# Altium project 5-SignalLight.PrjPcb (part 1 of 2)
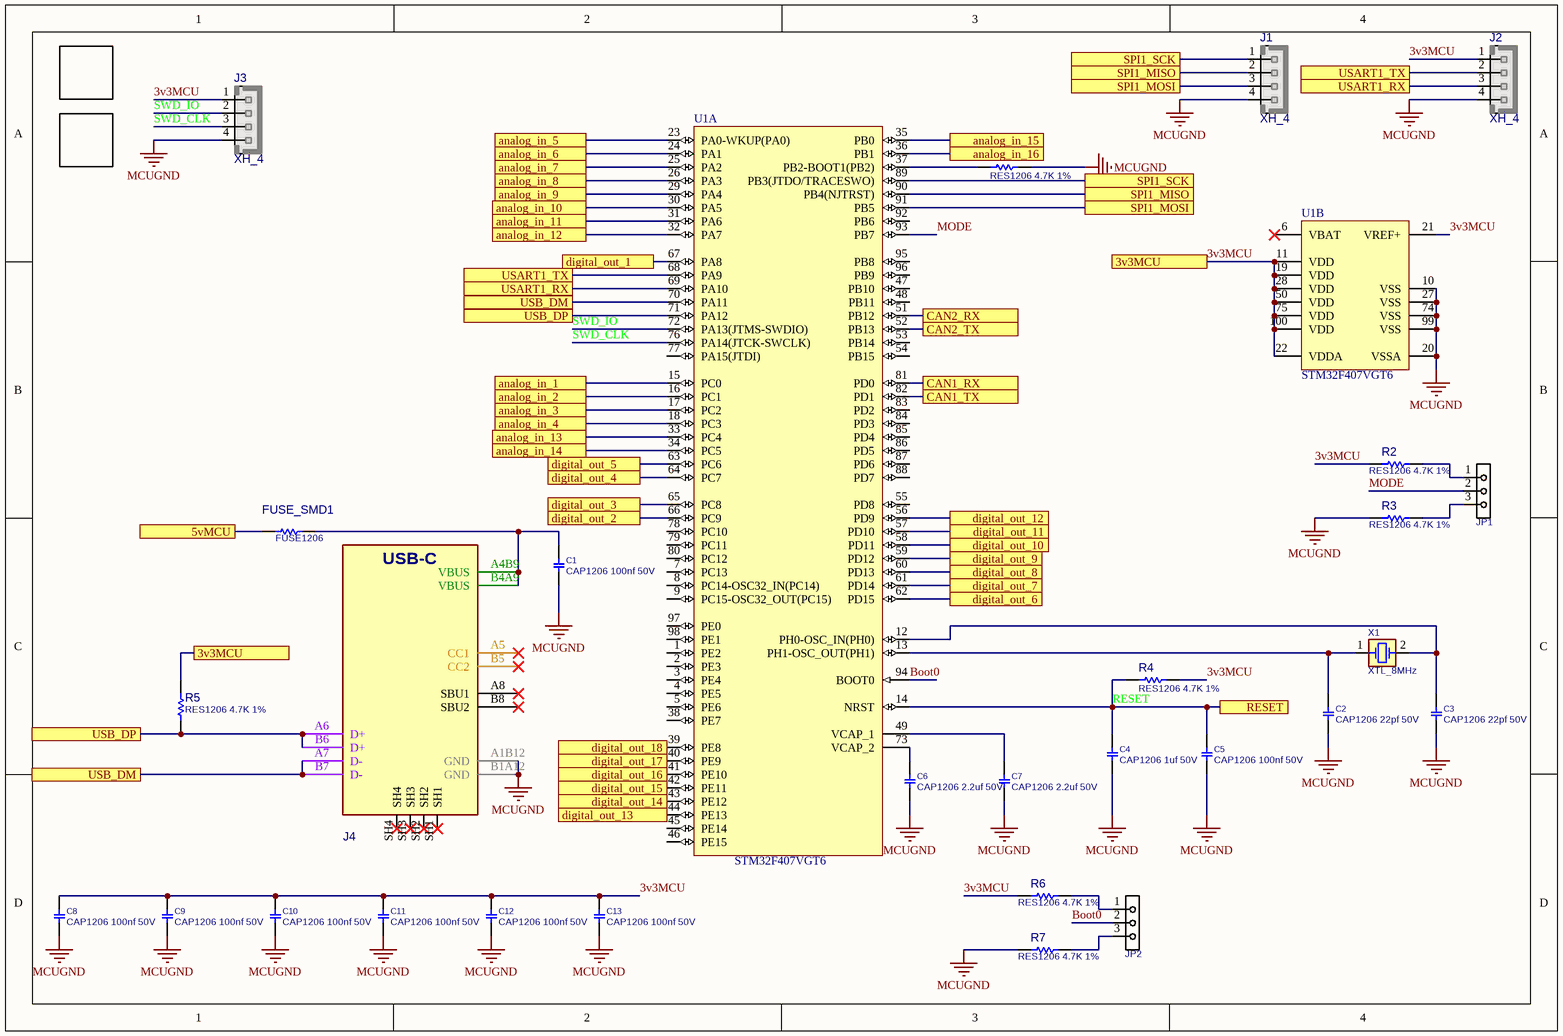
[diagram p0: MCU.SchDoc]
21 sheets, 460 parts. Net scope: flat (ports and power ports of the same name join across sheets).
Board file: SL-PCB1.PcbDoc
Sheets:
  MCU.SchDoc
  CAN.SchDoc
  power.SchDoc
  signal-light-1.SchDoc
  signal-light-2.SchDoc
  signal-light-3.SchDoc
  signal-light-4.SchDoc
  signal-light-5.SchDoc
  signal-light-6.SchDoc
  signal-light-7.SchDoc
  signal-light-8.SchDoc
  signal-light-9.SchDoc
  signal-light-10.SchDoc
  signal-light-11.SchDoc
  signal-light-12.SchDoc
  signal-light-13.SchDoc
  signal-light-14.SchDoc
  signal-light-15.SchDoc
  signal-light-16.SchDoc
  signal-light-17.SchDoc
  signal-light-18.SchDoc

## Sheet MCU.SchDoc
size A4; DocumentNumber: 1; SheetNumber: 1; SheetTotal: 21

### Parts
C1  CAP1206 100nf 50V  [C1206]
C2  CAP1206 22pf 50V  [C1206]
C3  CAP1206 22pf 50V  [C1206]
C4  CAP1206 1uf 50V  [C1206]
C5  CAP1206 100nf 50V  [C1206]
C6  CAP1206 2.2uf 50V  [C1206]
C7  CAP1206 2.2uf 50V  [C1206]
C8  CAP1206 100nf 50V  [C1206]
C9  CAP1206 100nf 50V  [C1206]
C10  CAP1206 100nf 50V  [C1206]
C11  CAP1206 100nf 50V  [C1206]
C12  CAP1206 100nf 50V  [C1206]
C13  CAP1206 100nf 50V  [C1206]
FUSE_SMD1  FUSE1206  [R1206]
J1  XH_4  [XH_4]
J2  XH_4  [XH_4]
J3  XH_4  [XH_4]
J4  DX07S016JA1  [USBC_SMD_16_DX07S016JA1]  (value not drawn)
JP1  JMPHDR3PIN  [JPH_3]  (value not drawn)
JP2  JMPHDR3PIN  [JPH_3]  (value not drawn)
R1  RES1206 4.7K 1%  [R1206]
R2  RES1206 4.7K 1%  [R1206]
R3  RES1206 4.7K 1%  [R1206]
R4  RES1206 4.7K 1%  [R1206]
R5  RES1206 4.7K 1%  [R1206]
R6  RES1206 4.7K 1%  [R1206]
R7  RES1206 4.7K 1%  [R1206]
RAMON1  WWW.RAMONIC.COM  [PCBComponent_1]  (value not drawn)
RAMON2  WWW.RAMONIC.COM  [PCBComponent_1]  (value not drawn)
U1  STM32F407VGT6  [STM-LQFP100_N]  (parts A,B of 2)
X1  XTL_8MHz  [XTL_2_11X5]

### Ports
3v3MCU, 5vMCU, analog_in_1, analog_in_2, analog_in_3, analog_in_4, analog_in_5, analog_in_6, analog_in_7, analog_in_8, analog_in_9, analog_in_10, analog_in_11, analog_in_12, analog_in_13, analog_in_14, analog_in_15, analog_in_16, CAN1_RX, CAN1_TX, CAN2_RX, CAN2_TX, digital_out_1, digital_out_2, digital_out_3, digital_out_4, digital_out_5, digital_out_6, digital_out_7, digital_out_8, digital_out_9, digital_out_10, digital_out_11, digital_out_12, digital_out_13, digital_out_14, digital_out_15, digital_out_16, digital_out_17, digital_out_18, RESET, SPI1_MISO, SPI1_MOSI, SPI1_SCK, USART1_RX, USART1_TX, USB_DM, USB_DP

### Nets
MCUGND: C1.1 C2.1 C3.1 C4.1 C5.1 C6.1 C7.1 C8.1 C9.1 C10.1 C11.1 C12.1 C13.1 J1.4 J2.4 J3.4 J4.A1B12(GND) J4.B1A12(GND) R1.2 R3.2 R7.2 U1.10(VSS) U1.20(VSSA) U1.27(VSS) U1.74(VSS) U1.99(VSS)
3v3MCU: C8.2 C9.2 C10.2 C11.2 C12.2 C13.2 J2.1 J3.1 R2.2 R4.2 R5.1 R6.2 U1.11(VDD) U1.19(VDD) U1.21(VREF+) U1.22(VDDA) U1.28(VDD) U1.50(VDD) U1.75(VDD) U1.100(VDD) ; port 3v3MCU
5vMCU: FUSE_SMD1.1 ; port 5vMCU
analog_in_1: U1.15(PC0) ; port analog_in_1
analog_in_2: U1.16(PC1) ; port analog_in_2
analog_in_3: U1.17(PC2) ; port analog_in_3
analog_in_4: U1.18(PC3) ; port analog_in_4
analog_in_5: U1.23(PA0-WKUP(PA0)) ; port analog_in_5
analog_in_6: U1.24(PA1) ; port analog_in_6
analog_in_7: U1.25(PA2) ; port analog_in_7
analog_in_8: U1.26(PA3) ; port analog_in_8
analog_in_9: U1.29(PA4) ; port analog_in_9
analog_in_10: U1.30(PA5) ; port analog_in_10
analog_in_11: U1.31(PA6) ; port analog_in_11
analog_in_12: U1.32(PA7) ; port analog_in_12
analog_in_13: U1.33(PC4) ; port analog_in_13
analog_in_14: U1.34(PC5) ; port analog_in_14
analog_in_15: U1.35(PB0) ; port analog_in_15
analog_in_16: U1.36(PB1) ; port analog_in_16
Boot0: JP2.2 U1.94(BOOT0)
MODE: JP1.2 U1.93(PB7)
RESET: C4.2 C5.2 R4.1 U1.14(NRST) ; port RESET
SWD_CLK: J3.3 U1.76(PA14(JTCK-SWCLK))
SWD_IO: J3.2 U1.72(PA13(JTMS-SWDIO))
NetB1_1: U1.81(PD0) ; port CAN1_RX
NetB1_4: U1.82(PD1) ; port CAN1_TX
NetB2_1: U1.51(PB12) ; port CAN2_RX
NetB2_4: U1.52(PB13) ; port CAN2_TX
NetC1_2: C1.2 FUSE_SMD1.2 J4.A4B9(VBUS) J4.B4A9(VBUS)
NetC2_2: C2.2 U1.13(PH1-OSC_OUT(PH1)) X1.1(OSC1)
NetC3_2: C3.2 U1.12(PH0-OSC_IN(PH0)) X1.2(OSC2)
NetC6_2: C6.2 U1.73(VCAP_2)
NetC7_2: C7.2 U1.49(VCAP_1)
NetJ1_1: J1.1 U1.89(PB3(JTDO/TRACESWO)) ; port SPI1_SCK
NetJ1_2: J1.2 U1.90(PB4(NJTRST)) ; port SPI1_MISO
NetJ1_3: J1.3 U1.91(PB5) ; port SPI1_MOSI
NetJ2_2: J2.2 U1.68(PA9) ; port USART1_TX
NetJ2_3: J2.3 U1.69(PA10) ; port USART1_RX
NetJ4_A6: J4.A6(D+) J4.B6(D+) R5.2 U1.71(PA12) ; port USB_DP
NetJ4_A7: J4.A7(D-) J4.B7(D-) U1.70(PA11) ; port USB_DM
NetJP1_1: JP1.1 R2.1
NetJP1_3: JP1.3 R3.1
NetJP2_1: JP2.1 R6.1
NetJP2_3: JP2.3 R7.1
NetR1_1: R1.1 U1.37(PB2-BOOT1(PB2))
NetR26_1: U1.67(PA8) ; port digital_out_1
NetR37_1: U1.66(PC9) ; port digital_out_2
NetR48_1: U1.65(PC8) ; port digital_out_3
NetR59_1: U1.64(PC7) ; port digital_out_4
NetR70_1: U1.63(PC6) ; port digital_out_5
NetR81_1: U1.62(PD15) ; port digital_out_6
NetR92_1: U1.61(PD14) ; port digital_out_7
NetR103_1: U1.60(PD13) ; port digital_out_8
NetR114_1: U1.59(PD12) ; port digital_out_9
NetR125_1: U1.58(PD11) ; port digital_out_10
NetR136_1: U1.57(PD10) ; port digital_out_11
NetR147_1: U1.56(PD9) ; port digital_out_12
NetR158_1: U1.44(PE13) ; port digital_out_13
NetR169_1: U1.43(PE12) ; port digital_out_14
NetR180_1: U1.42(PE11) ; port digital_out_15
NetR191_1: U1.41(PE10) ; port digital_out_16
NetR202_1: U1.40(PE9) ; port digital_out_17
NetR212_1: U1.39(PE8) ; port digital_out_18

Not connected (* = marked no-connect by the designer): J4 A5(CC1)* A8(SBU1)* B5(CC2)* B8(SBU2)* SH1* SH2* SH3* SH4*; U1 1(PE2) 2(PE3) 3(PE4) 4(PE5) 5(PE6) 6(VBAT)* 7(PC13) 8(PC14-OSC32_IN(PC14)) 9(PC15-OSC32_OUT(PC15)) 38(PE7) 45(PE14) 46(PE15) 47(PB10) 48(PB11) 53(PB14) 54(PB15) 55(PD8) 77(PA15(JTDI)) 78(PC10) 79(PC11) 80(PC12) 83(PD2) 84(PD3) 85(PD4) 86(PD5) 87(PD6) 88(PD7) 92(PB6) 95(PB8) 96(PB9) 97(PE0) 98(PE1)

### Notes on the sheet
- (in symbol CONN_USBC_SMD_16_DX07S016JA1) USB-C

### Library data of the parts
C1-C13 = CAP_SMD_MLCC_1206: CAP, MLCC; PARAM: -, -%; MANF_P#: MANF_PART#; PARAM2: -V; PRICE: 100= 1$; MANF: -; ASSEMBLY: ASSEMBLY
FUSE_SMD1 = RES_SMD_1206: resetable fuse; PARAM: 1%, 0.25W; DESC: DESCRIPTION; DIST#: MOUSER; MANF_P#: -; MANF: -; ASSEMBLY: ASSEMBLY; PRICE: -; PARAM2: -; VALUE: FUSE1206
J1-J3 = XH_4: PW10-x-M, JST-BxB-XH-A pitch: 2.5mm, 3A/250v; MANF: JST; MANF_P#: B4B-XH-A; PARAM2: 250v; PARAM: 3.0A; VALUE: XH_4
J4 = CONN_USBC_SMD_16_DX07S016JA1: CONN, USB, Type C, USB 2.0, Right-Angle, SMD; MANF: JAE; MANF_P#: DX07S016JA1R1500; PARAM: 5A; Price: 1.5$; Value: DX07S016JA1
JP1 JP2 = JUMPER_HDR_3P: JUMPER, HEADER 3PIN; MANF: MANF; MANF_P#: MANF_P#; VALUE: JMPHDR3PIN
R1-R7 = RES_SMD_1206: RESISTOR, SMD; PARAM: 1%, 0.25W; DESC: DESCRIPTION; DIST#: MOUSER; MANF_P#: -; MANF: -; ASSEMBLY: ASSEMBLY; PRICE: -; PARAM2: -
RAMON1 RAMON2 = RamonLogo
U1 = STM32F407VGT6: ARM Cortex-M4 32-bit MCU+FPU, 210 DMIPS, 1024 kB Flash, 192 kB Internal RAM, 82 I/Os, 100-pin LQFP, -40 to 85 degC, Tray; Manufacturer: STMicroelectronics; D/A Converter: 2x12-bit; FLASH Size (Prog) (kB): 1024; I/Os (High Current): 82; Internal RAM Size (kB): 192; Operating Frequency(F) (Processor speed) (MHz): 168; Supply Voltage(Vcc) max (V): 3.6; Supply Voltage(Vcc) min (V): 1.8; DatasheetVersion: Rev. 4; PackageVersion: Rev. 1, 06/2013; PackageReference: LQFP100; PackageDescription: 100-Pin Low Profile Quad Flat Package, 14 x 14 mm Body, 0.5 mm Pitch; Supplier 1: Digi-Key; Supplier Part Number 1: 497-11605-ND; Supplier 2: Farnell; Supplier Part Number 2: 2064368; Supplier 3: Newark; Supplier Part Number 3: 73T2333; Supplier 4: Mouser; Supplier Part Number 4: 511-STM32F407VGT6; Core: ARM Cortex-M4; Packing: Tray; Mounting Technology: Surface Mount; PartNumber: STM32F407VGT6; ComponentLink1Description: Manufacturer URL; ComponentLink1URL: http://www.st.com/web/en/home.html; ComponentLink2Description: Datasheet; ComponentLink2URL: http://www.st.com/st-web-ui/static/active/en/resource/technical/document/datasheet/DM00037051.pdf; ComponentLink3Description: Package Specification; ComponentLink3URL: http://www.st.com/st-web-ui/static/active/en/resource/technical/document/data_brief/DM00071938.pdf
X1 = XTL_2_HC49_8MHz_SMD: Crystal MOST POPULAR ABL HC49 PACKAGE; MANF: ABRACON; MANF_P#: ABLS-8.000MHZ-B4-T; PARAM: 8MHz, 18pF, 30PPM, -20~70oC; PRICE: 0.3$; VALUE: XTL_8MHz

## Sheet CAN.SchDoc
size A4; SheetNumber: 2; SheetTotal: 21
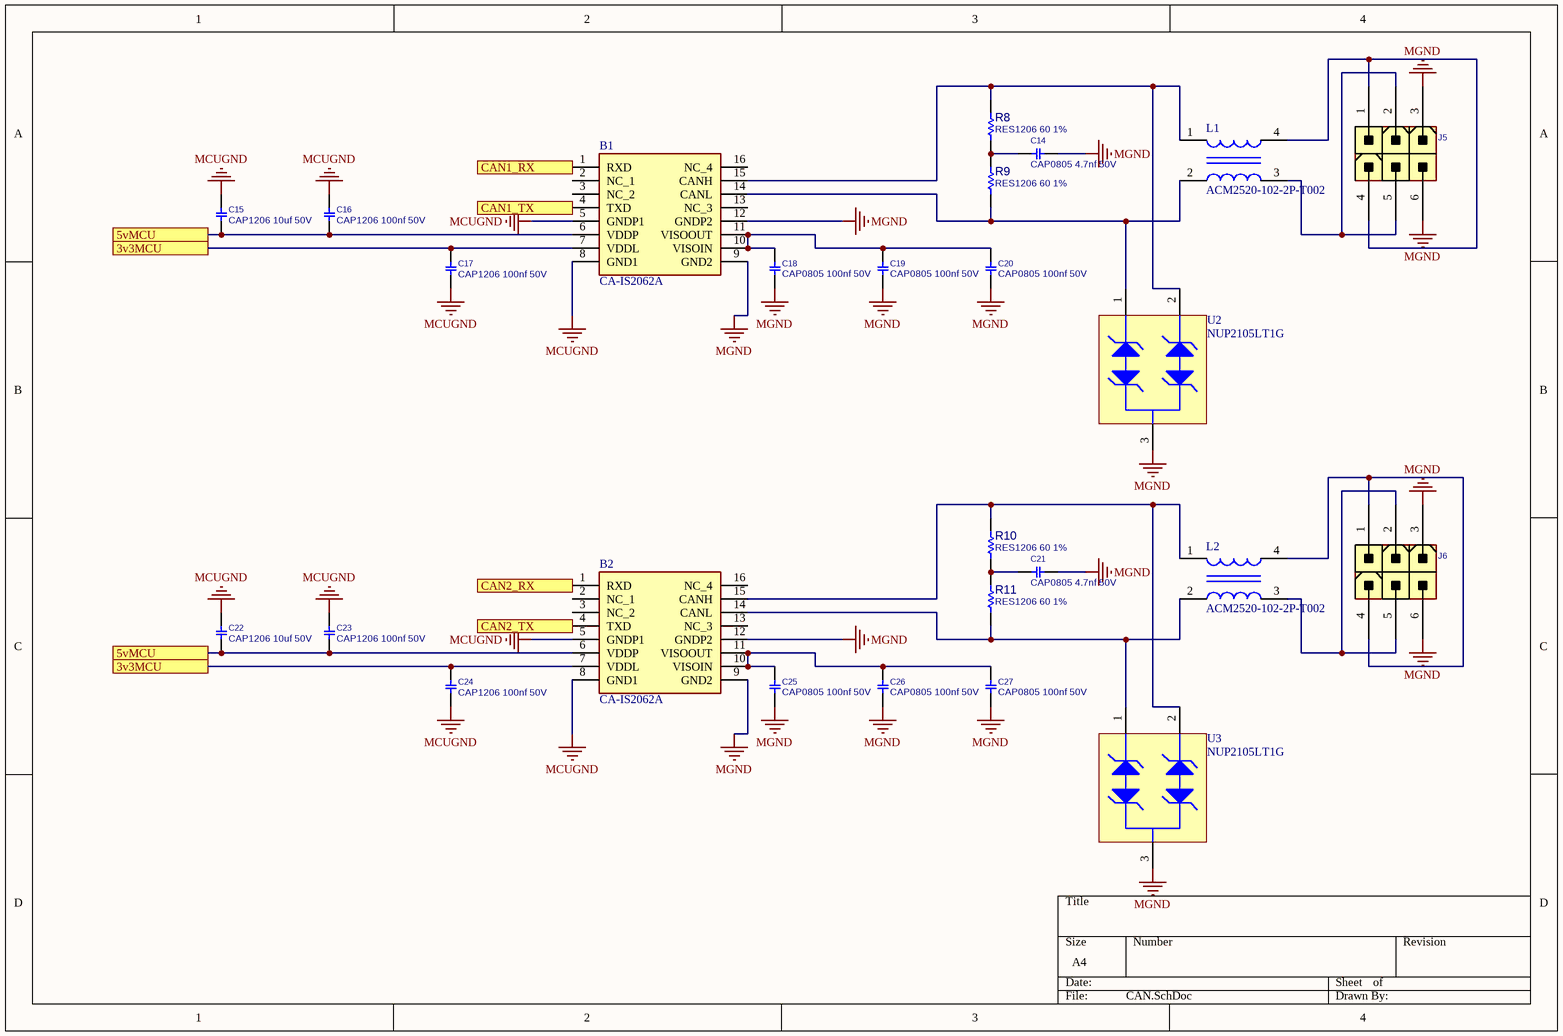
[diagram p1: CAN.SchDoc]

### Parts
B1  CA-IS2062A  [CAIS2062A]
B2  CA-IS2062A  [CAIS2062A]
C14  CAP0805 4.7nf 50V  [C0805]
C15  CAP1206 10uf 50V  [C1206]
C16  CAP1206 100nf 50V  [C1206]
C17  CAP1206 100nf 50V  [C1206]
C18  CAP0805 100nf 50V  [C0805]
C19  CAP0805 100nf 50V  [C0805]
C20  CAP0805 100nf 50V  [C0805]
C21  CAP0805 4.7nf 50V  [C0805]
C22  CAP1206 10uf 50V  [C1206]
C23  CAP1206 100nf 50V  [C1206]
C24  CAP1206 100nf 50V  [C1206]
C25  CAP0805 100nf 50V  [C0805]
C26  CAP0805 100nf 50V  [C0805]
C27  CAP0805 100nf 50V  [C0805]
J5  CONN_ATXPWR_6  [ATXPWR_6]  (value not drawn)
J6  CONN_ATXPWR_6  [ATXPWR_6]  (value not drawn)
L1  ACM2520-102-2P-T002  [FP-ACM2520-2P-MFG]
L2  ACM2520-102-2P-T002  [FP-ACM2520-2P-MFG]
R8  RES1206 60 1%  [R0805]
R9  RES1206 60 1%  [R0805]
R10  RES1206 60 1%  [R0805]
R11  RES1206 60 1%  [R0805]
U2  NUP2105LT1G  [PRKT-SOT23-3_V]
U3  NUP2105LT1G  [PRKT-SOT23-3_V]

### Ports
3v3MCU, 5vMCU, CAN1_RX, CAN1_TX, CAN2_RX, CAN2_TX

### Nets
MCUGND: B1.5(GNDP1) B1.8(GND1) B2.5(GNDP1) B2.8(GND1) C15.1 C16.1 C17.2 C22.1 C23.1 C24.2
MGND: B1.9(GND2) B1.12(GNDP2) B2.9(GND2) B2.12(GNDP2) C14.2 C18.1 C19.1 C20.1 C21.2 C25.1 C26.1 C27.1 J5.3 J5.6 J6.3 J6.6 U2.3 U3.3
3v3MCU: B1.7(VDDL) B2.7(VDDL) C17.1 C24.1 ; port 3v3MCU
5vMCU: B1.6(VDDP) B2.6(VDDP) C15.2 C16.2 C22.2 C23.2 ; port 5vMCU
NetB1_1: B1.1(RXD) ; port CAN1_RX
NetB1_4: B1.4(TXD) ; port CAN1_TX
NetB1_10: B1.10(VISOIN) B1.11(VISOOUT) C18.2 C19.2 C20.2
NetB1_14: B1.14(CANL) L1.2 R9.1 U2.1
NetB1_15: B1.15(CANH) L1.1 R8.2 U2.2
NetB2_1: B2.1(RXD) ; port CAN2_RX
NetB2_4: B2.4(TXD) ; port CAN2_TX
NetB2_10: B2.10(VISOIN) B2.11(VISOOUT) C25.2 C26.2 C27.2
NetB2_14: B2.14(CANL) L2.2 R11.1 U3.1
NetB2_15: B2.15(CANH) L2.1 R10.2 U3.2
NetC14_1: C14.1 R8.1 R9.2
NetC21_1: C21.1 R10.1 R11.2
NetJ5_1: J5.1 J5.4 L1.4
NetJ5_2: J5.2 J5.5 L1.3
NetJ6_1: J6.1 J6.4 L2.4
NetJ6_2: J6.2 J6.5 L2.3

Not connected (* = marked no-connect by the designer): B1 2(NC_1) 3(NC_2) 13(NC_3) 16(NC_4); B2 2(NC_1) 3(NC_2) 13(NC_3) 16(NC_4)

### Library data of the parts
B1 B2 = CA-IS2062A: LGA-16(4.7x5.2) Isolated CAN Transceivers (with Power) ROHS; Manufacturer_Name: ChipAnalog; Geometry.Height: 1.09mm; Manufacturer_Part_Number: CA-IS2062A; Mouser Part Number: *; Mouser Price/Stock: *; Arrow Part Number: *; Arrow Price/Stock: *; Datasheet Link: https://e.chipanalog.com/Public/Uploads/uploadfile/files/20250325/CAIS2062AdatasheetVersion1.01en20250325.pdf
C14 C18-C21 C25-C27 = CAP_SMD_MLCC_0805: CAP, MLCC; PARAM: -, -%; MANF_P#: MANF_PART#; PARAM2: -V; PRICE: 100= 1$; MANF: -; ASSEMBLY: ASSEMBLY
C15-C17 C22-C24 = CAP_SMD_MLCC_1206: as C1 on sheet MCU; PRICE: 100= 1$; MANF: -; ASSEMBLY: ASSEMBLY
J5 J6 = CONN_ATXPWR_6: CONN, ATX POWER, 6 P; MANF: TE; MANF_P#: 4-1775099-1; VALUE: CONN_ATXPWR_6; MountType: THD; PACKAGE: ATXPWR-6pin; Part Type: Conn.
L1 L2 = CMP-08256-000009-1: CMC 200MA 2LN 1KOHM SMD; Number of Lines: 2; Impedance: 1kR; Test Frequency: 100MHz; DC Resistance (DCR): 900mR; Voltage Rating: 20V; Series: ACM; Lead Free: Lead Free; Height: 0.051inch; Length: 0.098inch; Max DC Current: 200mA; Depth: 2.2mm; Package Quantity: 1; Case/Package: 1008; Max Operating Temperature: 85°C; Termination: SMD/SMT; Min Operating Temperature: -40°C; Packaging: Tape and Reel; DC Current: 200mA; Current: 200mA; Mount: Surface Mount; Width: 0.079inch
R8-R11 = RES_SMD_0805: RESISTOR, SMD; PARAM: -W; DESC: DESCRIPTION; DIST#: MOUSER; MANF_P#: -; MANF: -; ASSEMBLY: ASSEMBLY; PRICE: 100= 0.5$; PARAM2: 1%
U2 U3 = CMP-2000-07553-1: TVS Array - Asymmetrical Data Line Protector, 600 W, 7.5 V, -55 to 150 degC, 3-Pin SOT23, RoHS, Tape and Reel; Manufacturer: Protek Devices; Min Breakdown Voltage: 7.5V; Direction: Bidirectional; Capacitance: 75pF; Current: 20uA; Power Dissipation: 600W; Working Voltage: 7V; Voltage: 12V; Case\/Package: SOT-23; Clamping Voltage: 17V; Element Configuration: Dual; Mounting Technology: SurfaceMount; RoHSCompliant: True; Radiation Hardening: No; Depth: 1.4mm; Lead Free: LeadFree; Package Description: 3-Pin Small Outline Transistor, Body 2.92 x 1.3 mm, Pitch 0.94 mm; Max Operating Temperature: 150degC; Length: 3.04mm; Manufacturer URL: http://www.protekdevices.com/; Min Operating Temperature: -55degC; Leakage Current: 20uA; Datasheet URL: www.protekdevices.com/xyz/documents/datasheets/psm712.pdf; Packaging: TapeandReel; Datasheet Version: 10/2013; Package Reference: SOT23-3; Number of Pins: 3

## Sheet power.SchDoc
size A4; SheetNumber: 3; SheetTotal: 21
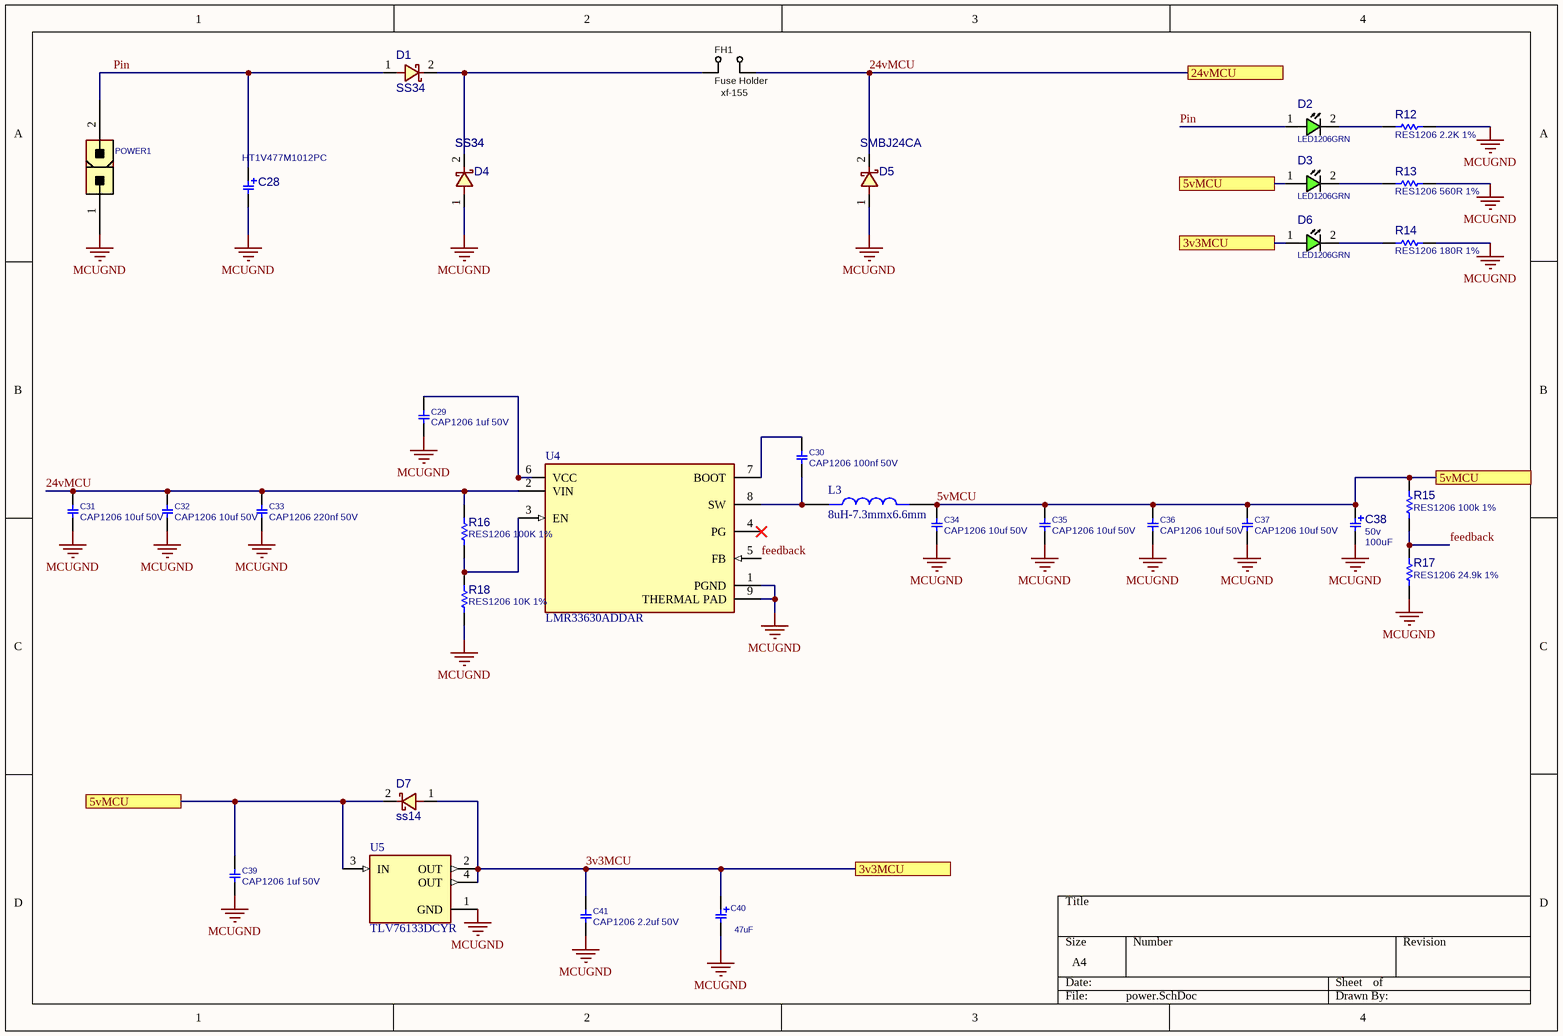
[diagram p2: power.SchDoc]

### Parts
C28  HT1V477M1012PC  [C_EL_10X16]
C29  CAP1206 1uf 50V  [C1206]
C30  CAP1206 100nf 50V  [C1206]
C31  CAP1206 10uf 50V  [C1206]
C32  CAP1206 10uf 50V  [C1206]
C33  CAP1206 220nf 50V  [C1206]
C34  CAP1206 10uf 50V  [C1206]
C35  CAP1206 10uf 50V  [C1206]
C36  CAP1206 10uf 50V  [C1206]
C37  CAP1206 10uf 50V  [C1206]
C38  PARAM2: 50v  [C_EL_8X12]  (hidden comment: 100uF)
C39  CAP1206 1uf 50V  [C1206]
C40  47uF  [C_TN_3528]
C41  CAP1206 2.2uf 50V  [C1206]
D1  SS34  [D_SMB]
D2  LED1206GRN  [LED1206GRN]
D3  LED1206GRN  [LED1206GRN]
D4  SS34  [D_SMB]
D5  SMBJ24CA  [D_SMB]
D6  LED1206GRN  [LED1206GRN]
D7  ss14  [D_SMA]
FH1  xf-155  value Fuse Holder  [FH_24101812]
L3  8uH-7.3mmx6.6mm  [IND_AMPLA7050S-100MT]
POWER1  CONN_ATXPWR_2  [ATXPWR_2]  (value not drawn)
R12  RES1206 2.2K 1%  [R1206]
R13  RES1206 560R 1%  [R1206]
R14  RES1206 180R 1%  [R1206]
R15  RES1206 100k 1%  [R1206]
R16  RES1206 100K 1%  [R1206]
R17  RES1206 24.9k 1%  [R1206]
R18  RES1206 10K 1%  [R1206]
U4  LMR33630ADDAR  [FP-DDA0008J-IPC_C]
U5  TLV76133DCYR  [VREG_TLV76133DCYR]

### Ports
3v3MCU, 5vMCU, 24vMCU

### Nets
MCUGND: C28.2 C29.2 C31.2 C32.2 C33.2 C34.2 C35.2 C36.2 C37.2 C38.2 C39.2 C40.2 C41.2 D4.1 D5.1 POWER1.1 R12.1 R13.1 R14.1 R17.1 R18.2 U4.1(PGND) U4.9(THERMAL_PAD) U5.1(GND)
3v3MCU: C40.1 C41.1 D6.1(ANODE) D7.1 U5.2(OUT) U5.4(OUT) ; port 3v3MCU
5vMCU: C34.1 C35.1 C36.1 C37.1 C38.1 C39.1 D3.1(ANODE) D7.2 L3.2 R15.2 U5.3(IN) ; port 5vMCU
24vMCU: C31.1 C32.1 C33.1 D5.2 FH1.2 R16.1 U4.2(VIN) ; port 24vMCU
feedback: R15.1 R17.2 U4.5(FB)
Pin: C28.1 D1.1 D2.1(ANODE) POWER1.2
NetC29_1: C29.1 U4.6(VCC)
NetC30_1: C30.1 U4.7(BOOT)
NetC30_2: C30.2 L3.1 U4.8(SW)
NetD1_2: D1.2 D4.2 FH1.1
NetD2_2: D2.2(CATHODE) R12.2
NetD3_2: D3.2(CATHODE) R13.2
NetD6_2: D6.2(CATHODE) R14.2
NetR16_2: R16.2 R18.1 U4.3(EN)

Not connected (* = marked no-connect by the designer): U4 4(PG)*

### Library data of the parts
C28 = CAP_THD_EL_470uF_35v: CAP, THD, ELEC,; MANF_P#: MANF_PART#; DESC: DESCRIPTION; DIST#: MOUSER; PARAM: 20%; PARAM2: 35v; VALUE: 470uF; PRICE: 10= -$; MANF: MANF; ASSEMBLY: ASSEMBLY
C29-C37 C39 C41 = CAP_SMD_MLCC_1206: as C1 on sheet MCU; PRICE: 100= 1$; MANF: -; ASSEMBLY: ASSEMBLY
C38 = CAP_THD_EL_100uF_50v: CAP, THD, ELEC,; MANF_P#: MANF_PART#; DESC: DESCRIPTION; DIST#: MOUSER; PARAM: 20%; PRICE: 10= -$; MANF: MANF; ASSEMBLY: ASSEMBLY; VALUE: 100uF
C40 = CAP_SMD_TAN: CAP, SMD, TAN; PARAM: 20%, 300mOhm, -55~105oC; MANF: VISHAY; MANF_P#: T55A106M6R3C0300; PARAM2: 6.3V; PRICE: 0.46$; VALUE: 47uF
D1 D4 = DIODE_SMD_SCHOTTKY_SS34: DIODE, SCHOTTKY, 20V, 3A; MANF: VISHAY; DESC: DESCRIPTION; ASSEMBLY: ASSEMBLY; PRICE: PRICE; PARAM2: 3A; PARAM: 20V; VALUE: SS34
  D4: MANF_P#: SS34
D2 D3 D6 = LED_SMD_1206_GRN: LED, SMD, 1206, GREEN; PARAM: 20mA; DESC: DESCRIPTION; PARAM2: 2.2V; MANF: -; ASSEMBLY: ASSEMBLY; PRICE: 36t@Javan; MANF_P#: -; VALUE: LED1206GRN; MountType: SMT; PartType: LED
D5 = DIODE_SMD_SCHOTTKY_SS34: DIODE,TVS, 24V, 15A; MANF: VISHAY; MANF_P#: SS34; DESC: DESCRIPTION; PARAM2: 3A; PARAM: 20V; ASSEMBLY: ASSEMBLY; PRICE: PRICE; VALUE: SMBJ24CA
D7 = DIODE_SMD_SCHOTTKY_B345A: DIODE, SCHOTTKY, 40V, 3A; MANF: DIODES; MANF_P#: B345AE-13; DESC: DESCRIPTION; PARAM2: 45Vrrm, 0.45Vf; PARAM: 3A, -50~150oC; ASSEMBLY: ASSEMBLY; PRICE: 0.35$; VALUE: ss14
FH1 = FUSE_SMD_HOLDER_24101812: Fuse SMD2410 Holder; PARAM: max. 10A; MANF: Littelfuse; MANF_P#: 01550900M; PARAM2: 125v; PRICE: 0.2$; PACKAGE: SMD,5.0x9.7mm
L3 = AMPLA7050S-100MT: Inductor Power Shielded/Molded Wirewound 10uH 20% 100KHz Carbonyl Powder 4A 0.069Ohm DCR T/R; MF: Abracon Corporation; SnapEDA_Link: https://www.snapeda.com/parts/AMPLA7050S-100MT/Abracon/view-part/?ref=snap; Purchase-URL: https://pricing.snapeda.com/search/part/AMPLA7050S-100MT/?ref=eda; Package: Package; MP: AMPLA7050S-100MT; Price: None; Availability: In Stock; Check_prices: https://www.snapeda.com/parts/AMPLA7050S-100MT/Abracon/view-part/?ref=eda; Value: *
POWER1 = CONN_ATXPWR_2: CONN, ATX POWER, 2 P; MANF: Molex; MANF_P#: 39281023; VALUE: CONN_ATXPWR_2; MountType: THD; PACKAGE: ATXPWR-2pin; Part Type: Conn.
R12-R18 = RES_SMD_1206: as R1 on sheet MCU; MANF_P#: -; MANF: -; ASSEMBLY: ASSEMBLY; PRICE: -; PARAM2: -
U4 = CMP-04918-000184-1: IC REG BUCK ADJUSTABLE 3A 8SOPWR; Switching Frequency: 400kHz; Number of Outputs: 1; Output Configuration: Positive; Synchronous Rectifier: Yes; Min Output Voltage: 1V; Max Output Voltage: 24V; Max Input Voltage: 36V; Min Input Voltage: 3.8V; Output Current: 3A; Min Operating Temperature: -40°C; Max Operating Temperature: 125°C; Number of Pins: 8; RoHS Compliant: Yes; Mount: Surface Mount; Output Type: Adjustable; Packaging: Cut Tape
U5 = TLV76133DCYR: 1-A 16-V high-PSRR linear voltage regulator; MF: Texas Instruments; SnapEDA_Link: https://www.snapeda.com/parts/TLV76133DCYR/Texas+Instruments/view-part/?ref=snap; Package: SOT-223-4 Texas Instruments; Value: *; MP: TLV76133DCYR; Check_prices: https://www.snapeda.com/parts/TLV76133DCYR/Texas+Instruments/view-part/?ref=eda

## Sheet signal-light-1.SchDoc
size A4; SheetNumber: 4; SheetTotal: 21
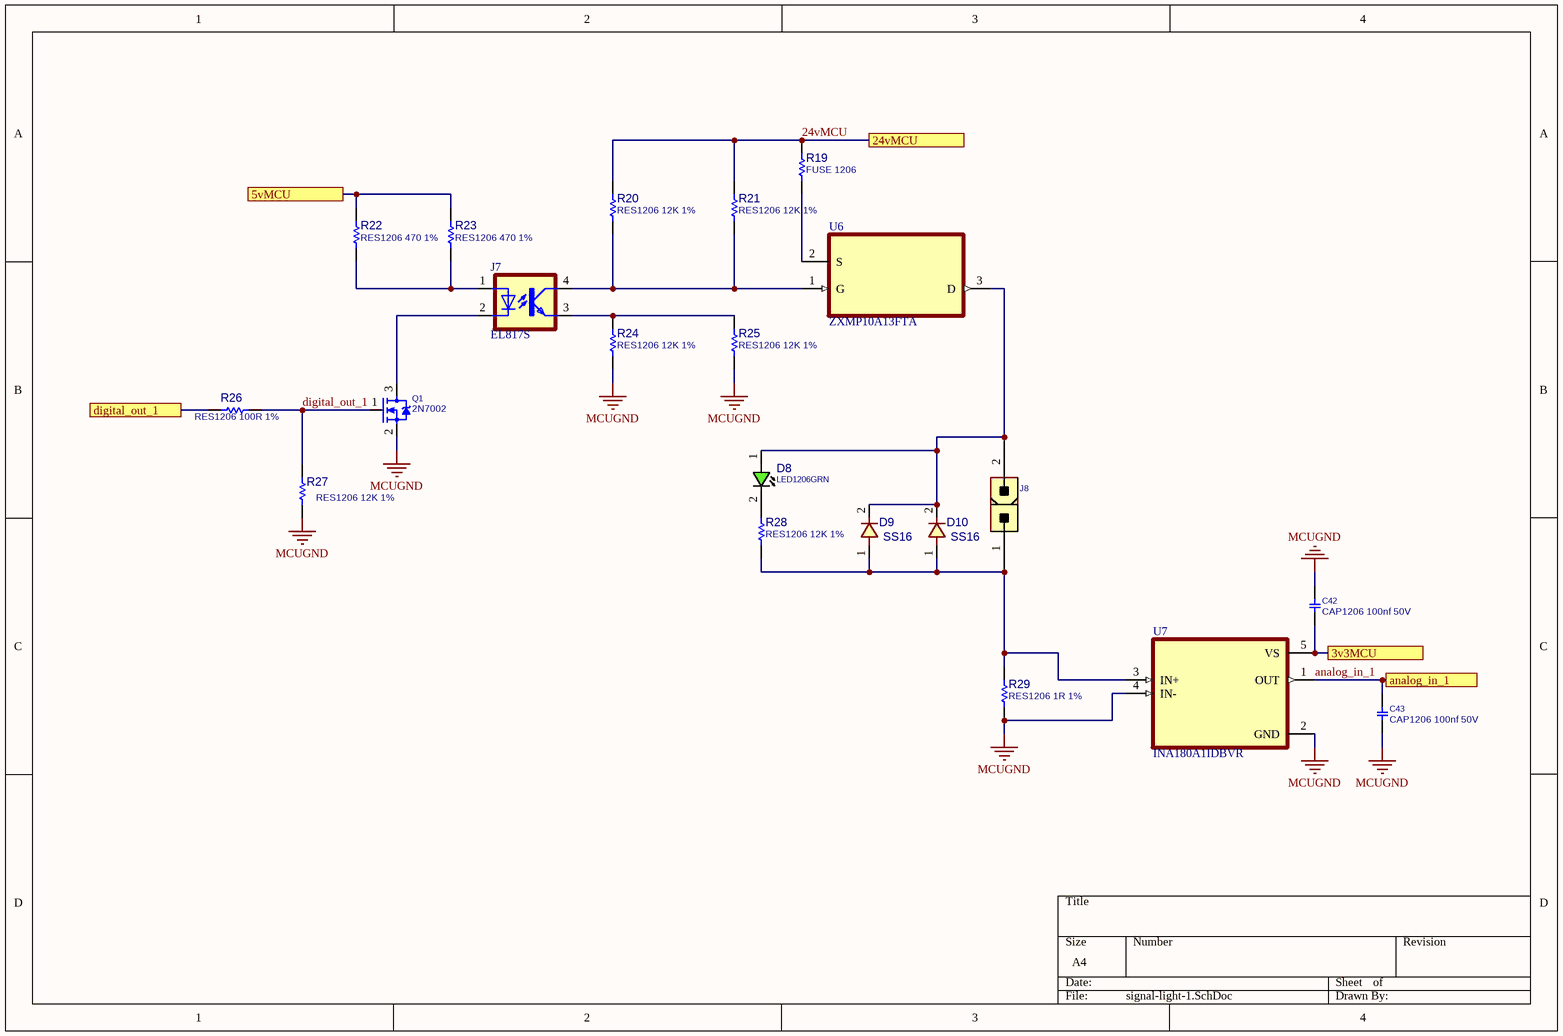
[diagram p3: signal-light-1.SchDoc]

### Parts
C42  CAP1206 100nf 50V  [C1206]
C43  CAP1206 100nf 50V  [C1206]
D8  LED1206GRN  [LED1206GRN]
D9  SS16  [D_SMA]
D10  SS16  [D_SMA]
J7  EL817S  [SOIC254P1030X460-4N]
J8  CONN_ATXPWR_2  [ATXPWR_2]  (value not drawn)
Q1  2N7002  [SOT23_3]
R19  FUSE 1206  [R1206]
R20  RES1206 12K 1%  [R1206]
R21  RES1206 12K 1%  [R1206]
R22  RES1206 470 1%  [R1206]
R23  RES1206 470 1%  [R1206]
R24  RES1206 12K 1%  [R1206]
R25  RES1206 12K 1%  [R1206]
R26  RES1206 100R 1%  [R1206]
R27  RES1206 12K 1%  [R1206]
R28  RES1206 12K 1%  [R1206]
R29  RES1206 1R 1%  [R1206]
U6  ZXMP10A13FTA  [SOT95P230X110-3N]
U7  INA180A1IDBVR  [SOT95P280X145-5N]

### Ports
3v3MCU, 5vMCU, 24vMCU, analog_in_1, digital_out_1

### Nets
MCUGND: C42.1 C43.2 Q1.2(SOURCE) R24.2 R25.2 R27.2 R29.2 U7.2(GND) U7.4(IN-)
3v3MCU: C42.2 U7.5(VS) ; port 3v3MCU
5vMCU: R22.2 R23.2 ; port 5vMCU
24vMCU: R19.1 R20.1 R21.1 ; port 24vMCU
analog_in_1: C43.1 U7.1(OUT) ; port analog_in_1
digital_out_1: Q1.1(GATE) R26.2 R27.1
NetD8_1: D8.1(ANODE) D9.2 D10.2 J8.2 U6.3(D)
NetD8_2: D8.2(CATHODE) R28.1
NetD9_1: D9.1 D10.1 J8.1 R28.2 R29.1 U7.3(IN+)
NetJ7_1: J7.1(A) R22.1 R23.1
NetJ7_2: J7.2(C) Q1.3(DRAIN)
NetJ7_3: J7.3(EMIT) R24.1 R25.1
NetJ7_4: J7.4(COL) R20.2 R21.2 U6.1(G)
NetR19_2: R19.2 U6.2(S)
NetR26_1: R26.1 ; port digital_out_1

### Library data of the parts
C42 C43 = CAP_SMD_MLCC_1206: as C1 on sheet MCU; PRICE: 100= 1$; MANF: -; ASSEMBLY: ASSEMBLY
D8 = LED_SMD_1206_GRN: as D2 on sheet power; MANF: -; ASSEMBLY: ASSEMBLY; PRICE: 36t@Javan; MANF_P#: -; VALUE: LED1206GRN; MountType: SMT; PartType: LED
D9 D10 = DIODE_SMD_1N4001: DIODE, GENERAL PURPOSE, 50V/1A; DESC: DESCRIPTION; PARAM: 50V VRRM; PARAM2: 1A; MANF_P#: 1N4001; MANF: MANF; ASSEMBLY: ASSEMBLY; PRICE: PRICE; VALUE: SS16
J7 = EL817S: Optoisolator Transistor Output 5000Vrms 1 Channel 4-SMD; MF: Everlight Electronics; SnapEDA_Link: https://www.snapeda.com/parts/EL817S/Everlight+Electronics+Co+Ltd/view-part/?ref=snap; Package: SMD-4 Everlight Electronics Co Ltd; Value: *; MP: EL817S; Check_prices: https://www.snapeda.com/parts/EL817S/Everlight+Electronics+Co+Ltd/view-part/?ref=eda
J8 = CONN_ATXPWR_2: as POWER1 on sheet power; VALUE: CONN_ATXPWR_2; MountType: THD; PACKAGE: ATXPWR-2pin; Part Type: Conn.
Q1 = MOSN_2N7002_SOT23: MOSFET, N-CH, 60V, 0.3A; MANF: NXP; ASSEMBLY: ASSEMBLY; MANF_P#: 2N7002; PARAM2: 60v; PARAM: 0.3A; PRICE: 0.3t@Javan; VALUE: 2N7002
R19-R29 = RES_SMD_1206: as R1 on sheet MCU; MANF_P#: -; MANF: -; ASSEMBLY: ASSEMBLY; PRICE: -; PARAM2: -
U6 = ZXMP10A13FTA: P-Channel 100 V 600mA (Ta) 625mW (Ta) Surface Mount SOT-23-3; MF: Diodes Inc.; Purchase-URL: https://pricing.snapeda.com/search/part/ZXMP10A13FTA/?ref=eda; Package: SOT-23-3 Diodes Inc.; SnapEDA_Link: https://www.snapeda.com/parts/ZXMP10A13FTA/Diodes+Inc./view-part/?ref=snap; Availability: In Stock; Value: *; MP: ZXMP10A13FTA; Check_prices: https://www.snapeda.com/parts/ZXMP10A13FTA/Diodes+Inc./view-part/?ref=eda; Price: None
U7 = INA180A1IDBVR: 26V, 350kHz current sense amplifier; MF: Texas Instruments; SnapEDA_Link: https://www.snapeda.com/parts/INA180A1IDBVR/Texas+Instruments/view-part/?ref=snap; Package: SOT-23-5 Texas Instruments; Value: *; MP: INA180A1IDBVR; Check_prices: https://www.snapeda.com/parts/INA180A1IDBVR/Texas+Instruments/view-part/?ref=eda

## Sheet signal-light-2.SchDoc
size A4; SheetNumber: 5; SheetTotal: 21
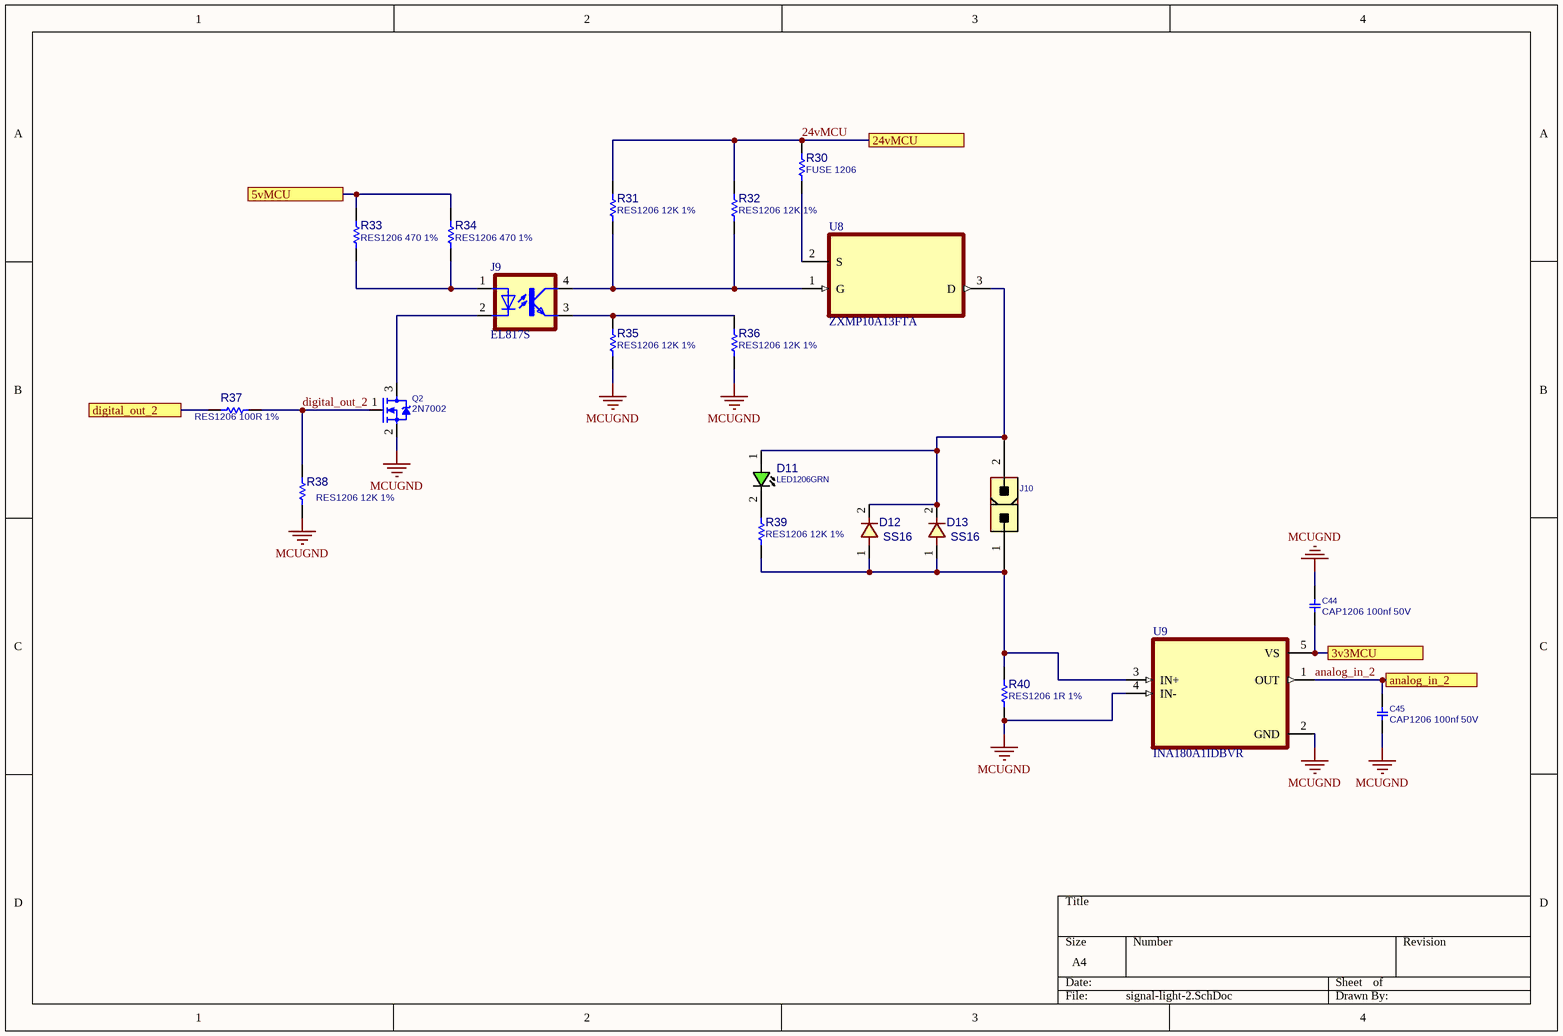
[diagram p4: signal-light-2.SchDoc]

### Parts
C44  CAP1206 100nf 50V  [C1206]
C45  CAP1206 100nf 50V  [C1206]
D11  LED1206GRN  [LED1206GRN]
D12  SS16  [D_SMA]
D13  SS16  [D_SMA]
J9  EL817S  [SOIC254P1030X460-4N]
J10  CONN_ATXPWR_2  [ATXPWR_2]  (value not drawn)
Q2  2N7002  [SOT23_3]
R30  FUSE 1206  [R1206]
R31  RES1206 12K 1%  [R1206]
R32  RES1206 12K 1%  [R1206]
R33  RES1206 470 1%  [R1206]
R34  RES1206 470 1%  [R1206]
R35  RES1206 12K 1%  [R1206]
R36  RES1206 12K 1%  [R1206]
R37  RES1206 100R 1%  [R1206]
R38  RES1206 12K 1%  [R1206]
R39  RES1206 12K 1%  [R1206]
R40  RES1206 1R 1%  [R1206]
U8  ZXMP10A13FTA  [SOT95P230X110-3N]
U9  INA180A1IDBVR  [SOT95P280X145-5N]

### Ports
3v3MCU, 5vMCU, 24vMCU, analog_in_2, digital_out_2

### Nets
MCUGND: C44.1 C45.2 Q2.2(SOURCE) R35.2 R36.2 R38.2 R40.2 U9.2(GND) U9.4(IN-)
3v3MCU: C44.2 U9.5(VS) ; port 3v3MCU
5vMCU: R33.2 R34.2 ; port 5vMCU
24vMCU: R30.1 R31.1 R32.1 ; port 24vMCU
analog_in_2: C45.1 U9.1(OUT) ; port analog_in_2
digital_out_2: Q2.1(GATE) R37.2 R38.1
NetD11_1: D11.1(ANODE) D12.2 D13.2 J10.2 U8.3(D)
NetD11_2: D11.2(CATHODE) R39.1
NetD12_1: D12.1 D13.1 J10.1 R39.2 R40.1 U9.3(IN+)
NetJ9_1: J9.1(A) R33.1 R34.1
NetJ9_2: J9.2(C) Q2.3(DRAIN)
NetJ9_3: J9.3(EMIT) R35.1 R36.1
NetJ9_4: J9.4(COL) R31.2 R32.2 U8.1(G)
NetR30_2: R30.2 U8.2(S)
NetR37_1: R37.1 ; port digital_out_2

### Library data of the parts
C44 C45 = CAP_SMD_MLCC_1206: as C1 on sheet MCU; PRICE: 100= 1$; MANF: -; ASSEMBLY: ASSEMBLY
D11 = LED_SMD_1206_GRN: as D2 on sheet power; MANF: -; ASSEMBLY: ASSEMBLY; PRICE: 36t@Javan; MANF_P#: -; VALUE: LED1206GRN; MountType: SMT; PartType: LED
D12 D13 = DIODE_SMD_1N4001: as D9 on sheet signal-light-1; MANF: MANF; ASSEMBLY: ASSEMBLY; PRICE: PRICE; VALUE: SS16
J9 = EL817S: as J7 on sheet signal-light-1; SnapEDA_Link: https://www.snapeda.com/parts/EL817S/Everlight+Electronics+Co+Ltd/view-part/?ref=snap; Package: SMD-4 Everlight Electronics Co Ltd; Value: *; MP: EL817S; Check_prices: https://www.snapeda.com/parts/EL817S/Everlight+Electronics+Co+Ltd/view-part/?ref=eda
J10 = CONN_ATXPWR_2: as POWER1 on sheet power; VALUE: CONN_ATXPWR_2; MountType: THD; PACKAGE: ATXPWR-2pin; Part Type: Conn.
Q2 = MOSN_2N7002_SOT23: MOSFET, N-CH, 60V, 0.3A; MANF: NXP; ASSEMBLY: ASSEMBLY; MANF_P#: 2N7002; PARAM2: 60v; PARAM: 0.3A; PRICE: 0.3t@Javan; VALUE: 2N7002
R30-R40 = RES_SMD_1206: as R1 on sheet MCU; MANF_P#: -; MANF: -; ASSEMBLY: ASSEMBLY; PRICE: -; PARAM2: -
U8 = ZXMP10A13FTA: as U6 on sheet signal-light-1; Purchase-URL: https://pricing.snapeda.com/search/part/ZXMP10A13FTA/?ref=eda; Package: SOT-23-3 Diodes Inc.; SnapEDA_Link: https://www.snapeda.com/parts/ZXMP10A13FTA/Diodes+Inc./view-part/?ref=snap; Availability: In Stock; Value: *; MP: ZXMP10A13FTA; Check_prices: https://www.snapeda.com/parts/ZXMP10A13FTA/Diodes+Inc./view-part/?ref=eda; Price: None
U9 = INA180A1IDBVR: as U7 on sheet signal-light-1; SnapEDA_Link: https://www.snapeda.com/parts/INA180A1IDBVR/Texas+Instruments/view-part/?ref=snap; Package: SOT-23-5 Texas Instruments; Value: *; MP: INA180A1IDBVR; Check_prices: https://www.snapeda.com/parts/INA180A1IDBVR/Texas+Instruments/view-part/?ref=eda

## Sheet signal-light-3.SchDoc
size A4; SheetNumber: 6; SheetTotal: 21
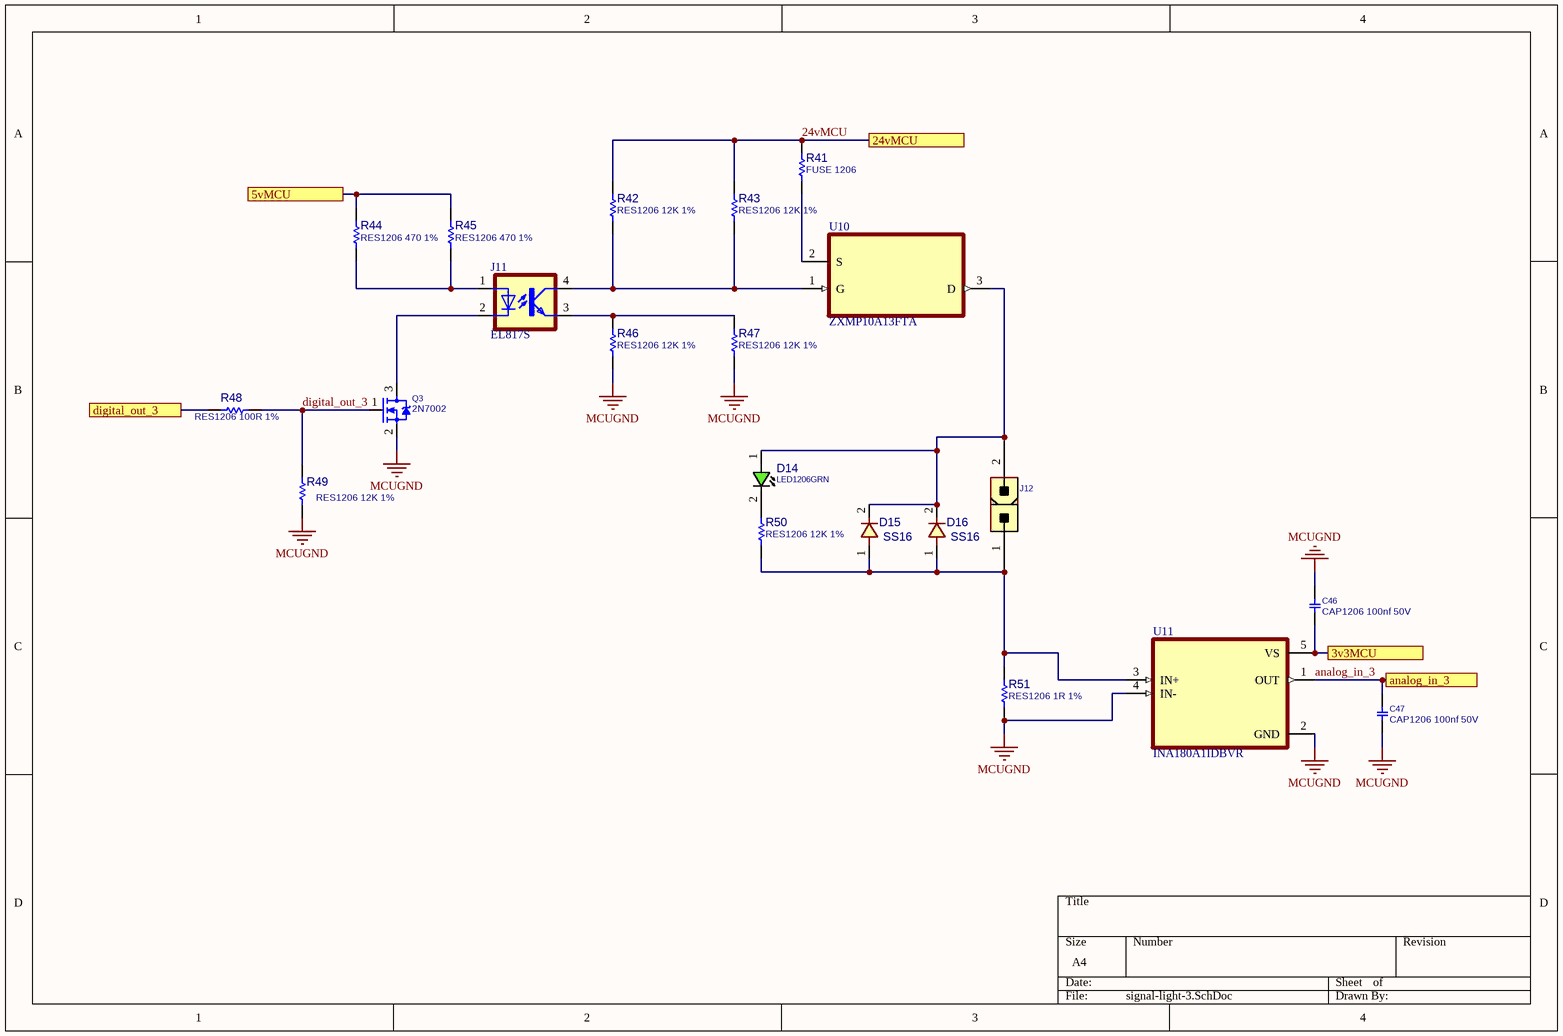
[diagram p5: signal-light-3.SchDoc]

### Parts
C46  CAP1206 100nf 50V  [C1206]
C47  CAP1206 100nf 50V  [C1206]
D14  LED1206GRN  [LED1206GRN]
D15  SS16  [D_SMA]
D16  SS16  [D_SMA]
J11  EL817S  [SOIC254P1030X460-4N]
J12  CONN_ATXPWR_2  [ATXPWR_2]  (value not drawn)
Q3  2N7002  [SOT23_3]
R41  FUSE 1206  [R1206]
R42  RES1206 12K 1%  [R1206]
R43  RES1206 12K 1%  [R1206]
R44  RES1206 470 1%  [R1206]
R45  RES1206 470 1%  [R1206]
R46  RES1206 12K 1%  [R1206]
R47  RES1206 12K 1%  [R1206]
R48  RES1206 100R 1%  [R1206]
R49  RES1206 12K 1%  [R1206]
R50  RES1206 12K 1%  [R1206]
R51  RES1206 1R 1%  [R1206]
U10  ZXMP10A13FTA  [SOT95P230X110-3N]
U11  INA180A1IDBVR  [SOT95P280X145-5N]

### Ports
3v3MCU, 5vMCU, 24vMCU, analog_in_3, digital_out_3

### Nets
MCUGND: C46.1 C47.2 Q3.2(SOURCE) R46.2 R47.2 R49.2 R51.2 U11.2(GND) U11.4(IN-)
3v3MCU: C46.2 U11.5(VS) ; port 3v3MCU
5vMCU: R44.2 R45.2 ; port 5vMCU
24vMCU: R41.1 R42.1 R43.1 ; port 24vMCU
analog_in_3: C47.1 U11.1(OUT) ; port analog_in_3
digital_out_3: Q3.1(GATE) R48.2 R49.1
NetD14_1: D14.1(ANODE) D15.2 D16.2 J12.2 U10.3(D)
NetD14_2: D14.2(CATHODE) R50.1
NetD15_1: D15.1 D16.1 J12.1 R50.2 R51.1 U11.3(IN+)
NetJ11_1: J11.1(A) R44.1 R45.1
NetJ11_2: J11.2(C) Q3.3(DRAIN)
NetJ11_3: J11.3(EMIT) R46.1 R47.1
NetJ11_4: J11.4(COL) R42.2 R43.2 U10.1(G)
NetR41_2: R41.2 U10.2(S)
NetR48_1: R48.1 ; port digital_out_3

### Library data of the parts
C46 C47 = CAP_SMD_MLCC_1206: as C1 on sheet MCU; PRICE: 100= 1$; MANF: -; ASSEMBLY: ASSEMBLY
D14 = LED_SMD_1206_GRN: as D2 on sheet power; MANF: -; ASSEMBLY: ASSEMBLY; PRICE: 36t@Javan; MANF_P#: -; VALUE: LED1206GRN; MountType: SMT; PartType: LED
D15 D16 = DIODE_SMD_1N4001: as D9 on sheet signal-light-1; MANF: MANF; ASSEMBLY: ASSEMBLY; PRICE: PRICE; VALUE: SS16
J11 = EL817S: as J7 on sheet signal-light-1; SnapEDA_Link: https://www.snapeda.com/parts/EL817S/Everlight+Electronics+Co+Ltd/view-part/?ref=snap; Package: SMD-4 Everlight Electronics Co Ltd; Value: *; MP: EL817S; Check_prices: https://www.snapeda.com/parts/EL817S/Everlight+Electronics+Co+Ltd/view-part/?ref=eda
J12 = CONN_ATXPWR_2: as POWER1 on sheet power; VALUE: CONN_ATXPWR_2; MountType: THD; PACKAGE: ATXPWR-2pin; Part Type: Conn.
Q3 = MOSN_2N7002_SOT23: MOSFET, N-CH, 60V, 0.3A; MANF: NXP; ASSEMBLY: ASSEMBLY; MANF_P#: 2N7002; PARAM2: 60v; PARAM: 0.3A; PRICE: 0.3t@Javan; VALUE: 2N7002
R41-R51 = RES_SMD_1206: as R1 on sheet MCU; MANF_P#: -; MANF: -; ASSEMBLY: ASSEMBLY; PRICE: -; PARAM2: -
U10 = ZXMP10A13FTA: as U6 on sheet signal-light-1; Purchase-URL: https://pricing.snapeda.com/search/part/ZXMP10A13FTA/?ref=eda; Package: SOT-23-3 Diodes Inc.; SnapEDA_Link: https://www.snapeda.com/parts/ZXMP10A13FTA/Diodes+Inc./view-part/?ref=snap; Availability: In Stock; Value: *; MP: ZXMP10A13FTA; Check_prices: https://www.snapeda.com/parts/ZXMP10A13FTA/Diodes+Inc./view-part/?ref=eda; Price: None
U11 = INA180A1IDBVR: as U7 on sheet signal-light-1; SnapEDA_Link: https://www.snapeda.com/parts/INA180A1IDBVR/Texas+Instruments/view-part/?ref=snap; Package: SOT-23-5 Texas Instruments; Value: *; MP: INA180A1IDBVR; Check_prices: https://www.snapeda.com/parts/INA180A1IDBVR/Texas+Instruments/view-part/?ref=eda

## Sheet signal-light-4.SchDoc
size A4; SheetNumber: 7; SheetTotal: 21
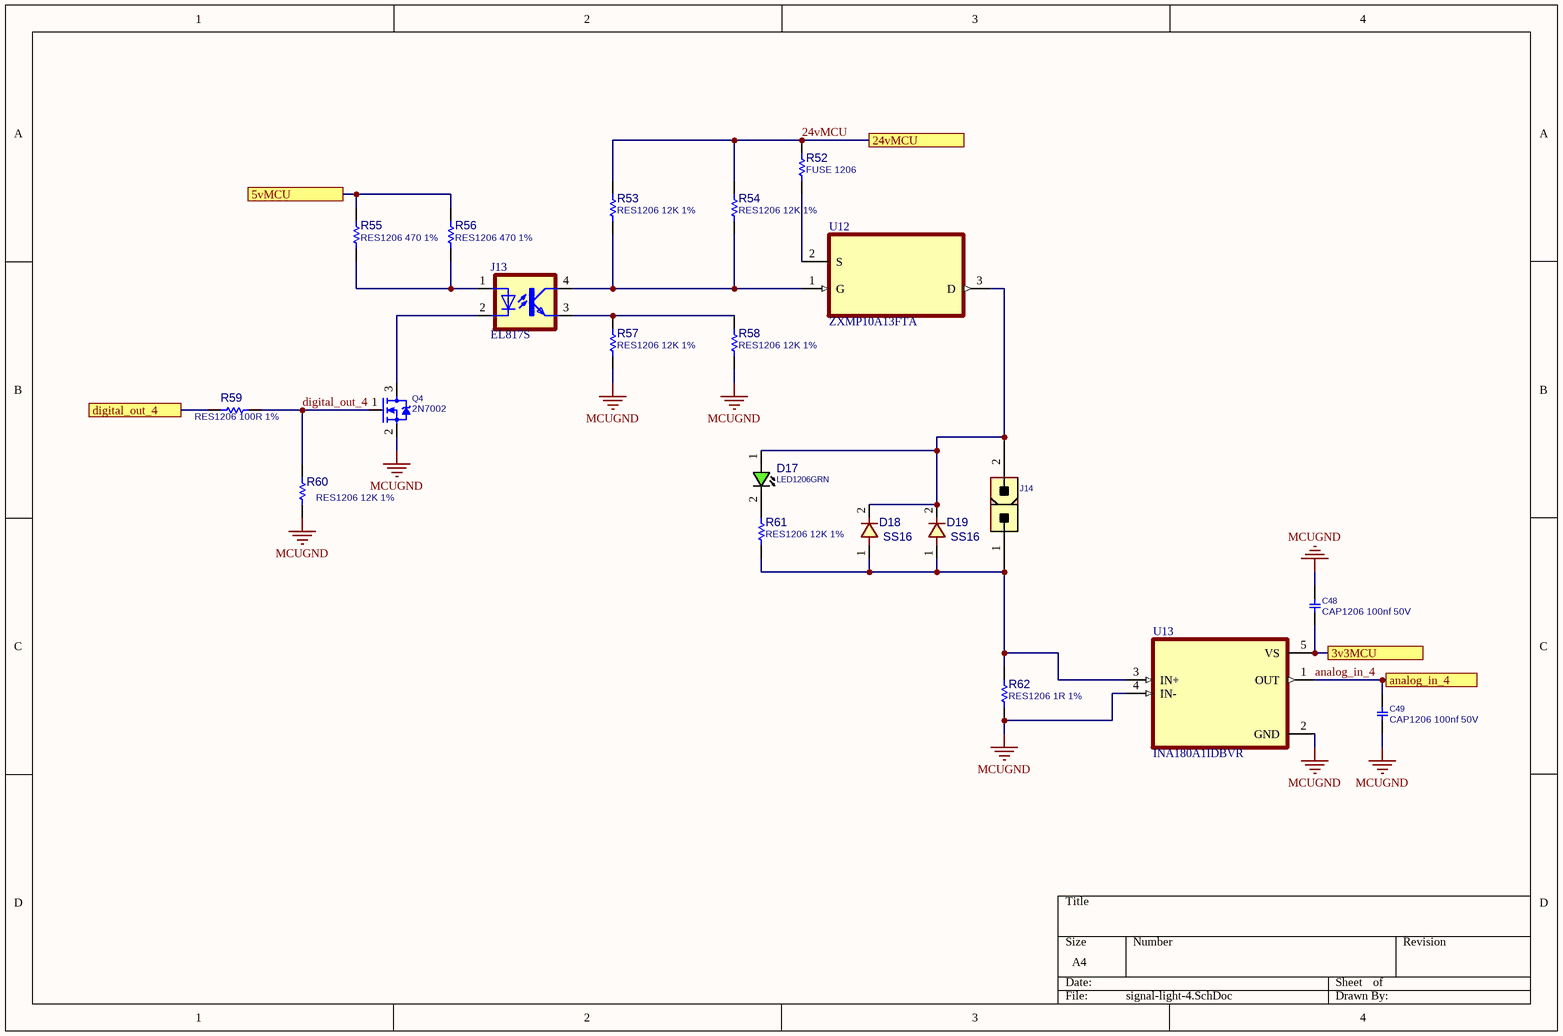
[diagram p6: signal-light-4.SchDoc]

### Parts
C48  CAP1206 100nf 50V  [C1206]
C49  CAP1206 100nf 50V  [C1206]
D17  LED1206GRN  [LED1206GRN]
D18  SS16  [D_SMA]
D19  SS16  [D_SMA]
J13  EL817S  [SOIC254P1030X460-4N]
J14  CONN_ATXPWR_2  [ATXPWR_2]  (value not drawn)
Q4  2N7002  [SOT23_3]
R52  FUSE 1206  [R1206]
R53  RES1206 12K 1%  [R1206]
R54  RES1206 12K 1%  [R1206]
R55  RES1206 470 1%  [R1206]
R56  RES1206 470 1%  [R1206]
R57  RES1206 12K 1%  [R1206]
R58  RES1206 12K 1%  [R1206]
R59  RES1206 100R 1%  [R1206]
R60  RES1206 12K 1%  [R1206]
R61  RES1206 12K 1%  [R1206]
R62  RES1206 1R 1%  [R1206]
U12  ZXMP10A13FTA  [SOT95P230X110-3N]
U13  INA180A1IDBVR  [SOT95P280X145-5N]

### Ports
3v3MCU, 5vMCU, 24vMCU, analog_in_4, digital_out_4

### Nets
MCUGND: C48.1 C49.2 Q4.2(SOURCE) R57.2 R58.2 R60.2 R62.2 U13.2(GND) U13.4(IN-)
3v3MCU: C48.2 U13.5(VS) ; port 3v3MCU
5vMCU: R55.2 R56.2 ; port 5vMCU
24vMCU: R52.1 R53.1 R54.1 ; port 24vMCU
analog_in_4: C49.1 U13.1(OUT) ; port analog_in_4
digital_out_4: Q4.1(GATE) R59.2 R60.1
NetD17_1: D17.1(ANODE) D18.2 D19.2 J14.2 U12.3(D)
NetD17_2: D17.2(CATHODE) R61.1
NetD18_1: D18.1 D19.1 J14.1 R61.2 R62.1 U13.3(IN+)
NetJ13_1: J13.1(A) R55.1 R56.1
NetJ13_2: J13.2(C) Q4.3(DRAIN)
NetJ13_3: J13.3(EMIT) R57.1 R58.1
NetJ13_4: J13.4(COL) R53.2 R54.2 U12.1(G)
NetR52_2: R52.2 U12.2(S)
NetR59_1: R59.1 ; port digital_out_4

### Library data of the parts
C48 C49 = CAP_SMD_MLCC_1206: as C1 on sheet MCU; PRICE: 100= 1$; MANF: -; ASSEMBLY: ASSEMBLY
D17 = LED_SMD_1206_GRN: as D2 on sheet power; MANF: -; ASSEMBLY: ASSEMBLY; PRICE: 36t@Javan; MANF_P#: -; VALUE: LED1206GRN; MountType: SMT; PartType: LED
D18 D19 = DIODE_SMD_1N4001: as D9 on sheet signal-light-1; MANF: MANF; ASSEMBLY: ASSEMBLY; PRICE: PRICE; VALUE: SS16
J13 = EL817S: as J7 on sheet signal-light-1; SnapEDA_Link: https://www.snapeda.com/parts/EL817S/Everlight+Electronics+Co+Ltd/view-part/?ref=snap; Package: SMD-4 Everlight Electronics Co Ltd; Value: *; MP: EL817S; Check_prices: https://www.snapeda.com/parts/EL817S/Everlight+Electronics+Co+Ltd/view-part/?ref=eda
J14 = CONN_ATXPWR_2: as POWER1 on sheet power; VALUE: CONN_ATXPWR_2; MountType: THD; PACKAGE: ATXPWR-2pin; Part Type: Conn.
Q4 = MOSN_2N7002_SOT23: MOSFET, N-CH, 60V, 0.3A; MANF: NXP; ASSEMBLY: ASSEMBLY; MANF_P#: 2N7002; PARAM2: 60v; PARAM: 0.3A; PRICE: 0.3t@Javan; VALUE: 2N7002
R52-R62 = RES_SMD_1206: as R1 on sheet MCU; MANF_P#: -; MANF: -; ASSEMBLY: ASSEMBLY; PRICE: -; PARAM2: -
U12 = ZXMP10A13FTA: as U6 on sheet signal-light-1; Purchase-URL: https://pricing.snapeda.com/search/part/ZXMP10A13FTA/?ref=eda; Package: SOT-23-3 Diodes Inc.; SnapEDA_Link: https://www.snapeda.com/parts/ZXMP10A13FTA/Diodes+Inc./view-part/?ref=snap; Availability: In Stock; Value: *; MP: ZXMP10A13FTA; Check_prices: https://www.snapeda.com/parts/ZXMP10A13FTA/Diodes+Inc./view-part/?ref=eda; Price: None
U13 = INA180A1IDBVR: as U7 on sheet signal-light-1; SnapEDA_Link: https://www.snapeda.com/parts/INA180A1IDBVR/Texas+Instruments/view-part/?ref=snap; Package: SOT-23-5 Texas Instruments; Value: *; MP: INA180A1IDBVR; Check_prices: https://www.snapeda.com/parts/INA180A1IDBVR/Texas+Instruments/view-part/?ref=eda

## Sheet signal-light-5.SchDoc
size A4; SheetNumber: 8; SheetTotal: 21
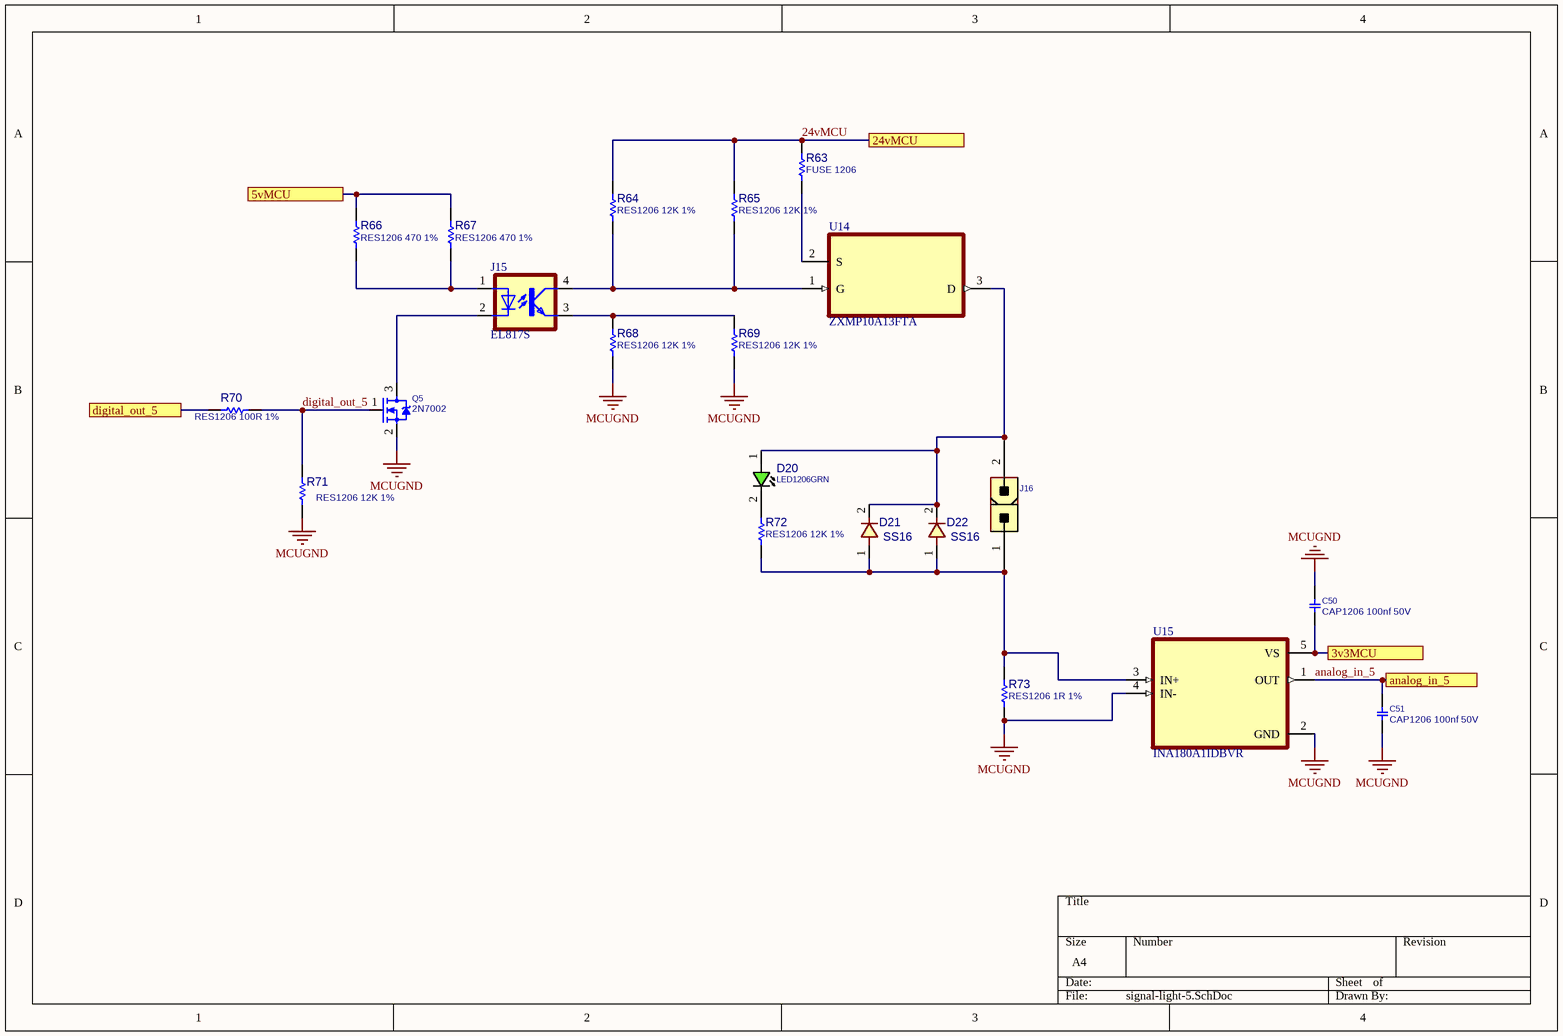
[diagram p7: signal-light-5.SchDoc]

### Parts
C50  CAP1206 100nf 50V  [C1206]
C51  CAP1206 100nf 50V  [C1206]
D20  LED1206GRN  [LED1206GRN]
D21  SS16  [D_SMA]
D22  SS16  [D_SMA]
J15  EL817S  [SOIC254P1030X460-4N]
J16  CONN_ATXPWR_2  [ATXPWR_2]  (value not drawn)
Q5  2N7002  [SOT23_3]
R63  FUSE 1206  [R1206]
R64  RES1206 12K 1%  [R1206]
R65  RES1206 12K 1%  [R1206]
R66  RES1206 470 1%  [R1206]
R67  RES1206 470 1%  [R1206]
R68  RES1206 12K 1%  [R1206]
R69  RES1206 12K 1%  [R1206]
R70  RES1206 100R 1%  [R1206]
R71  RES1206 12K 1%  [R1206]
R72  RES1206 12K 1%  [R1206]
R73  RES1206 1R 1%  [R1206]
U14  ZXMP10A13FTA  [SOT95P230X110-3N]
U15  INA180A1IDBVR  [SOT95P280X145-5N]

### Ports
3v3MCU, 5vMCU, 24vMCU, analog_in_5, digital_out_5

### Nets
MCUGND: C50.1 C51.2 Q5.2(SOURCE) R68.2 R69.2 R71.2 R73.2 U15.2(GND) U15.4(IN-)
3v3MCU: C50.2 U15.5(VS) ; port 3v3MCU
5vMCU: R66.2 R67.2 ; port 5vMCU
24vMCU: R63.1 R64.1 R65.1 ; port 24vMCU
analog_in_5: C51.1 U15.1(OUT) ; port analog_in_5
digital_out_5: Q5.1(GATE) R70.2 R71.1
NetD20_1: D20.1(ANODE) D21.2 D22.2 J16.2 U14.3(D)
NetD20_2: D20.2(CATHODE) R72.1
NetD21_1: D21.1 D22.1 J16.1 R72.2 R73.1 U15.3(IN+)
NetJ15_1: J15.1(A) R66.1 R67.1
NetJ15_2: J15.2(C) Q5.3(DRAIN)
NetJ15_3: J15.3(EMIT) R68.1 R69.1
NetJ15_4: J15.4(COL) R64.2 R65.2 U14.1(G)
NetR63_2: R63.2 U14.2(S)
NetR70_1: R70.1 ; port digital_out_5

### Library data of the parts
C50 C51 = CAP_SMD_MLCC_1206: as C1 on sheet MCU; PRICE: 100= 1$; MANF: -; ASSEMBLY: ASSEMBLY
D20 = LED_SMD_1206_GRN: as D2 on sheet power; MANF: -; ASSEMBLY: ASSEMBLY; PRICE: 36t@Javan; MANF_P#: -; VALUE: LED1206GRN; MountType: SMT; PartType: LED
D21 D22 = DIODE_SMD_1N4001: as D9 on sheet signal-light-1; MANF: MANF; ASSEMBLY: ASSEMBLY; PRICE: PRICE; VALUE: SS16
J15 = EL817S: as J7 on sheet signal-light-1; SnapEDA_Link: https://www.snapeda.com/parts/EL817S/Everlight+Electronics+Co+Ltd/view-part/?ref=snap; Package: SMD-4 Everlight Electronics Co Ltd; Value: *; MP: EL817S; Check_prices: https://www.snapeda.com/parts/EL817S/Everlight+Electronics+Co+Ltd/view-part/?ref=eda
J16 = CONN_ATXPWR_2: as POWER1 on sheet power; VALUE: CONN_ATXPWR_2; MountType: THD; PACKAGE: ATXPWR-2pin; Part Type: Conn.
Q5 = MOSN_2N7002_SOT23: MOSFET, N-CH, 60V, 0.3A; MANF: NXP; ASSEMBLY: ASSEMBLY; MANF_P#: 2N7002; PARAM2: 60v; PARAM: 0.3A; PRICE: 0.3t@Javan; VALUE: 2N7002
R63-R73 = RES_SMD_1206: as R1 on sheet MCU; MANF_P#: -; MANF: -; ASSEMBLY: ASSEMBLY; PRICE: -; PARAM2: -
U14 = ZXMP10A13FTA: as U6 on sheet signal-light-1; Purchase-URL: https://pricing.snapeda.com/search/part/ZXMP10A13FTA/?ref=eda; Package: SOT-23-3 Diodes Inc.; SnapEDA_Link: https://www.snapeda.com/parts/ZXMP10A13FTA/Diodes+Inc./view-part/?ref=snap; Availability: In Stock; Value: *; MP: ZXMP10A13FTA; Check_prices: https://www.snapeda.com/parts/ZXMP10A13FTA/Diodes+Inc./view-part/?ref=eda; Price: None
U15 = INA180A1IDBVR: as U7 on sheet signal-light-1; SnapEDA_Link: https://www.snapeda.com/parts/INA180A1IDBVR/Texas+Instruments/view-part/?ref=snap; Package: SOT-23-5 Texas Instruments; Value: *; MP: INA180A1IDBVR; Check_prices: https://www.snapeda.com/parts/INA180A1IDBVR/Texas+Instruments/view-part/?ref=eda

## Sheet signal-light-6.SchDoc
size A4; SheetNumber: 9; SheetTotal: 21
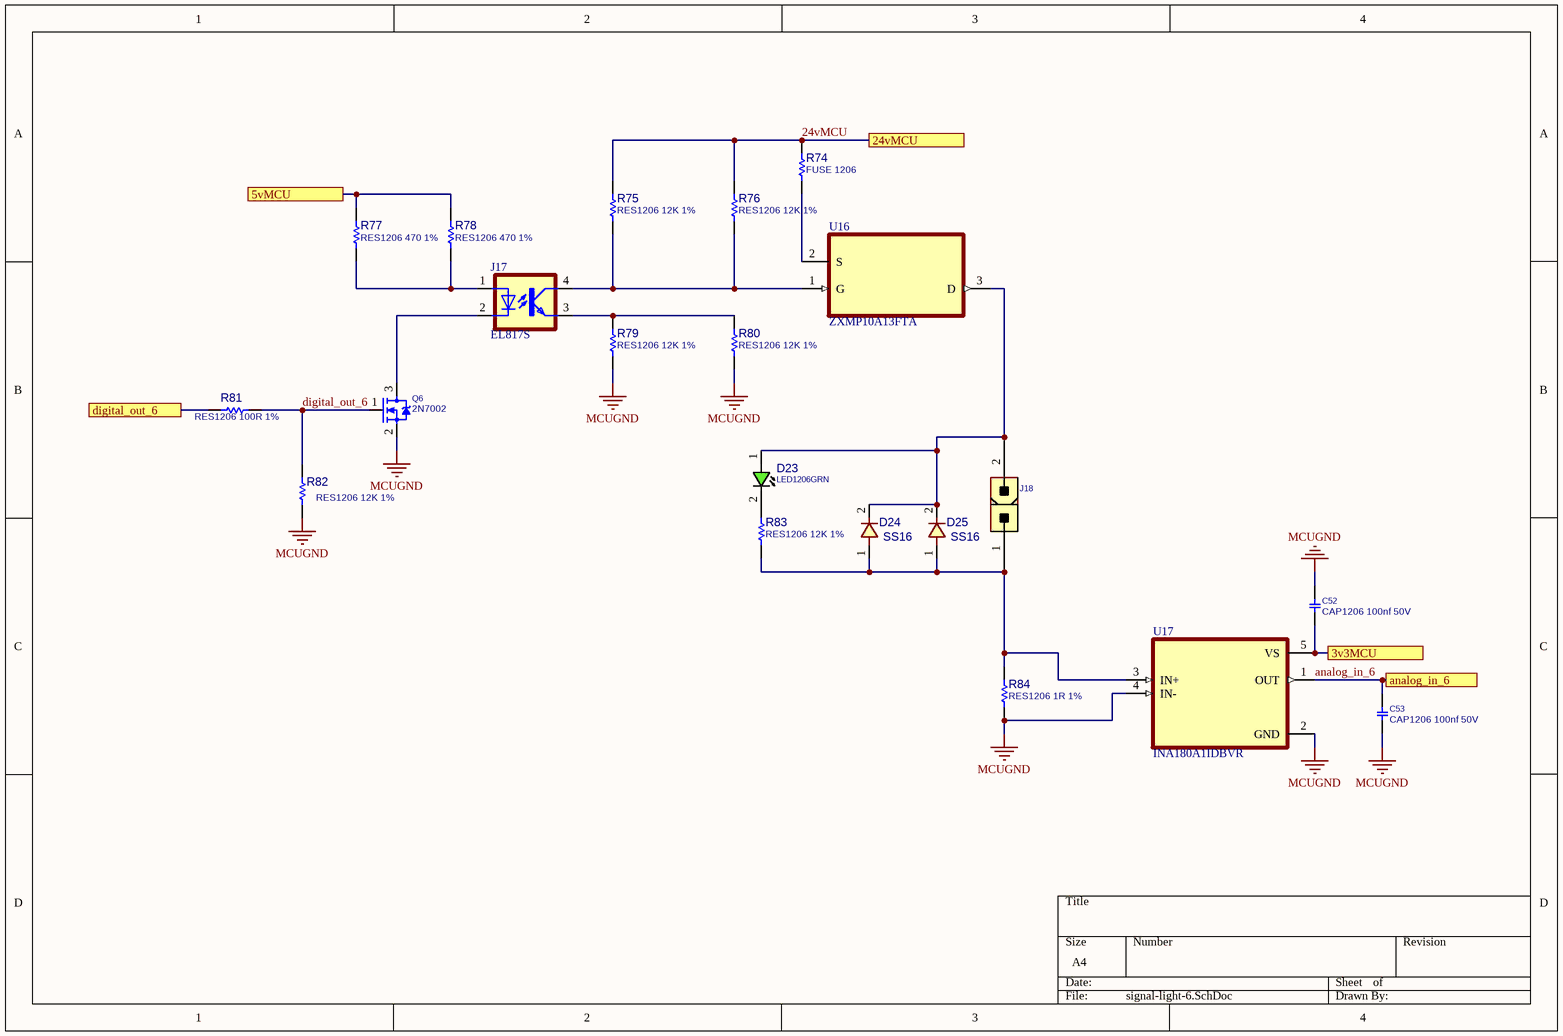
[diagram p8: signal-light-6.SchDoc]

### Parts
C52  CAP1206 100nf 50V  [C1206]
C53  CAP1206 100nf 50V  [C1206]
D23  LED1206GRN  [LED1206GRN]
D24  SS16  [D_SMA]
D25  SS16  [D_SMA]
J17  EL817S  [SOIC254P1030X460-4N]
J18  CONN_ATXPWR_2  [ATXPWR_2]  (value not drawn)
Q6  2N7002  [SOT23_3]
R74  FUSE 1206  [R1206]
R75  RES1206 12K 1%  [R1206]
R76  RES1206 12K 1%  [R1206]
R77  RES1206 470 1%  [R1206]
R78  RES1206 470 1%  [R1206]
R79  RES1206 12K 1%  [R1206]
R80  RES1206 12K 1%  [R1206]
R81  RES1206 100R 1%  [R1206]
R82  RES1206 12K 1%  [R1206]
R83  RES1206 12K 1%  [R1206]
R84  RES1206 1R 1%  [R1206]
U16  ZXMP10A13FTA  [SOT95P230X110-3N]
U17  INA180A1IDBVR  [SOT95P280X145-5N]

### Ports
3v3MCU, 5vMCU, 24vMCU, analog_in_6, digital_out_6

### Nets
MCUGND: C52.1 C53.2 Q6.2(SOURCE) R79.2 R80.2 R82.2 R84.2 U17.2(GND) U17.4(IN-)
3v3MCU: C52.2 U17.5(VS) ; port 3v3MCU
5vMCU: R77.2 R78.2 ; port 5vMCU
24vMCU: R74.1 R75.1 R76.1 ; port 24vMCU
analog_in_6: C53.1 U17.1(OUT) ; port analog_in_6
digital_out_6: Q6.1(GATE) R81.2 R82.1
NetD23_1: D23.1(ANODE) D24.2 D25.2 J18.2 U16.3(D)
NetD23_2: D23.2(CATHODE) R83.1
NetD24_1: D24.1 D25.1 J18.1 R83.2 R84.1 U17.3(IN+)
NetJ17_1: J17.1(A) R77.1 R78.1
NetJ17_2: J17.2(C) Q6.3(DRAIN)
NetJ17_3: J17.3(EMIT) R79.1 R80.1
NetJ17_4: J17.4(COL) R75.2 R76.2 U16.1(G)
NetR74_2: R74.2 U16.2(S)
NetR81_1: R81.1 ; port digital_out_6

### Library data of the parts
C52 C53 = CAP_SMD_MLCC_1206: as C1 on sheet MCU; PRICE: 100= 1$; MANF: -; ASSEMBLY: ASSEMBLY
D23 = LED_SMD_1206_GRN: as D2 on sheet power; MANF: -; ASSEMBLY: ASSEMBLY; PRICE: 36t@Javan; MANF_P#: -; VALUE: LED1206GRN; MountType: SMT; PartType: LED
D24 D25 = DIODE_SMD_1N4001: as D9 on sheet signal-light-1; MANF: MANF; ASSEMBLY: ASSEMBLY; PRICE: PRICE; VALUE: SS16
J17 = EL817S: as J7 on sheet signal-light-1; SnapEDA_Link: https://www.snapeda.com/parts/EL817S/Everlight+Electronics+Co+Ltd/view-part/?ref=snap; Package: SMD-4 Everlight Electronics Co Ltd; Value: *; MP: EL817S; Check_prices: https://www.snapeda.com/parts/EL817S/Everlight+Electronics+Co+Ltd/view-part/?ref=eda
J18 = CONN_ATXPWR_2: as POWER1 on sheet power; VALUE: CONN_ATXPWR_2; MountType: THD; PACKAGE: ATXPWR-2pin; Part Type: Conn.
Q6 = MOSN_2N7002_SOT23: MOSFET, N-CH, 60V, 0.3A; MANF: NXP; ASSEMBLY: ASSEMBLY; MANF_P#: 2N7002; PARAM2: 60v; PARAM: 0.3A; PRICE: 0.3t@Javan; VALUE: 2N7002
R74-R84 = RES_SMD_1206: as R1 on sheet MCU; MANF_P#: -; MANF: -; ASSEMBLY: ASSEMBLY; PRICE: -; PARAM2: -
U16 = ZXMP10A13FTA: as U6 on sheet signal-light-1; Purchase-URL: https://pricing.snapeda.com/search/part/ZXMP10A13FTA/?ref=eda; Package: SOT-23-3 Diodes Inc.; SnapEDA_Link: https://www.snapeda.com/parts/ZXMP10A13FTA/Diodes+Inc./view-part/?ref=snap; Availability: In Stock; Value: *; MP: ZXMP10A13FTA; Check_prices: https://www.snapeda.com/parts/ZXMP10A13FTA/Diodes+Inc./view-part/?ref=eda; Price: None
U17 = INA180A1IDBVR: as U7 on sheet signal-light-1; SnapEDA_Link: https://www.snapeda.com/parts/INA180A1IDBVR/Texas+Instruments/view-part/?ref=snap; Package: SOT-23-5 Texas Instruments; Value: *; MP: INA180A1IDBVR; Check_prices: https://www.snapeda.com/parts/INA180A1IDBVR/Texas+Instruments/view-part/?ref=eda

## Sheet signal-light-7.SchDoc
size A4; SheetNumber: 10; SheetTotal: 21
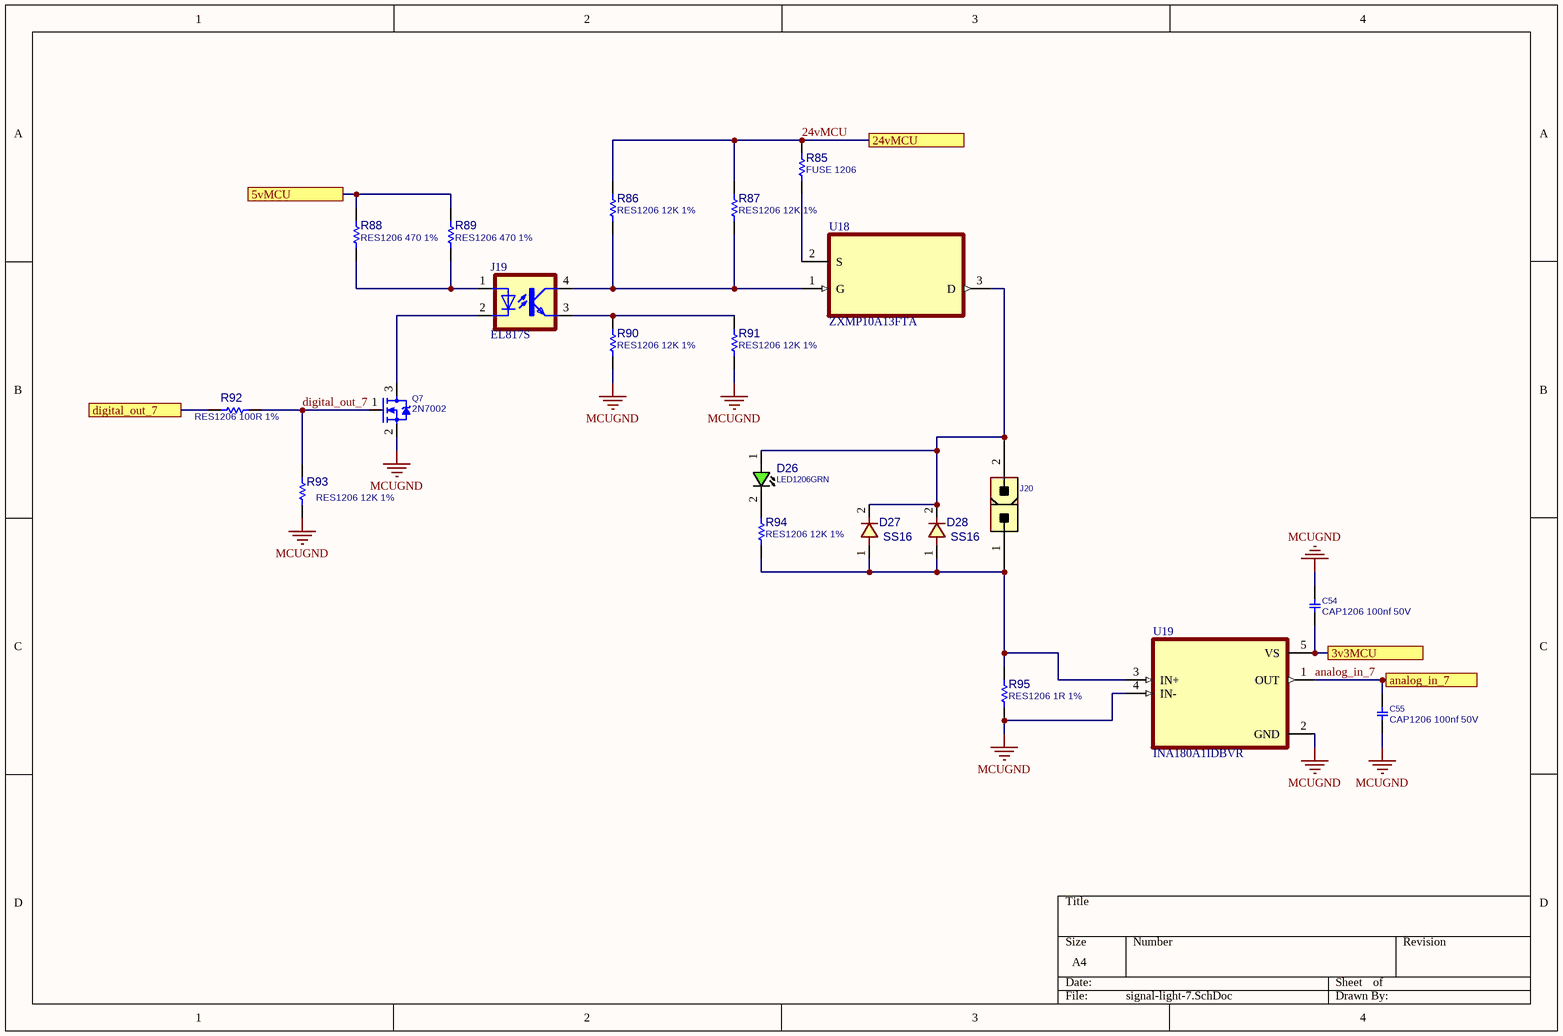
[diagram p9: signal-light-7.SchDoc]

### Parts
C54  CAP1206 100nf 50V  [C1206]
C55  CAP1206 100nf 50V  [C1206]
D26  LED1206GRN  [LED1206GRN]
D27  SS16  [D_SMA]
D28  SS16  [D_SMA]
J19  EL817S  [SOIC254P1030X460-4N]
J20  CONN_ATXPWR_2  [ATXPWR_2]  (value not drawn)
Q7  2N7002  [SOT23_3]
R85  FUSE 1206  [R1206]
R86  RES1206 12K 1%  [R1206]
R87  RES1206 12K 1%  [R1206]
R88  RES1206 470 1%  [R1206]
R89  RES1206 470 1%  [R1206]
R90  RES1206 12K 1%  [R1206]
R91  RES1206 12K 1%  [R1206]
R92  RES1206 100R 1%  [R1206]
R93  RES1206 12K 1%  [R1206]
R94  RES1206 12K 1%  [R1206]
R95  RES1206 1R 1%  [R1206]
U18  ZXMP10A13FTA  [SOT95P230X110-3N]
U19  INA180A1IDBVR  [SOT95P280X145-5N]

### Ports
3v3MCU, 5vMCU, 24vMCU, analog_in_7, digital_out_7

### Nets
MCUGND: C54.1 C55.2 Q7.2(SOURCE) R90.2 R91.2 R93.2 R95.2 U19.2(GND) U19.4(IN-)
3v3MCU: C54.2 U19.5(VS) ; port 3v3MCU
5vMCU: R88.2 R89.2 ; port 5vMCU
24vMCU: R85.1 R86.1 R87.1 ; port 24vMCU
analog_in_7: C55.1 U19.1(OUT) ; port analog_in_7
digital_out_7: Q7.1(GATE) R92.2 R93.1
NetD26_1: D26.1(ANODE) D27.2 D28.2 J20.2 U18.3(D)
NetD26_2: D26.2(CATHODE) R94.1
NetD27_1: D27.1 D28.1 J20.1 R94.2 R95.1 U19.3(IN+)
NetJ19_1: J19.1(A) R88.1 R89.1
NetJ19_2: J19.2(C) Q7.3(DRAIN)
NetJ19_3: J19.3(EMIT) R90.1 R91.1
NetJ19_4: J19.4(COL) R86.2 R87.2 U18.1(G)
NetR85_2: R85.2 U18.2(S)
NetR92_1: R92.1 ; port digital_out_7

### Library data of the parts
C54 C55 = CAP_SMD_MLCC_1206: as C1 on sheet MCU; PRICE: 100= 1$; MANF: -; ASSEMBLY: ASSEMBLY
D26 = LED_SMD_1206_GRN: as D2 on sheet power; MANF: -; ASSEMBLY: ASSEMBLY; PRICE: 36t@Javan; MANF_P#: -; VALUE: LED1206GRN; MountType: SMT; PartType: LED
D27 D28 = DIODE_SMD_1N4001: as D9 on sheet signal-light-1; MANF: MANF; ASSEMBLY: ASSEMBLY; PRICE: PRICE; VALUE: SS16
J19 = EL817S: as J7 on sheet signal-light-1; SnapEDA_Link: https://www.snapeda.com/parts/EL817S/Everlight+Electronics+Co+Ltd/view-part/?ref=snap; Package: SMD-4 Everlight Electronics Co Ltd; Value: *; MP: EL817S; Check_prices: https://www.snapeda.com/parts/EL817S/Everlight+Electronics+Co+Ltd/view-part/?ref=eda
J20 = CONN_ATXPWR_2: as POWER1 on sheet power; VALUE: CONN_ATXPWR_2; MountType: THD; PACKAGE: ATXPWR-2pin; Part Type: Conn.
Q7 = MOSN_2N7002_SOT23: MOSFET, N-CH, 60V, 0.3A; MANF: NXP; ASSEMBLY: ASSEMBLY; MANF_P#: 2N7002; PARAM2: 60v; PARAM: 0.3A; PRICE: 0.3t@Javan; VALUE: 2N7002
R85-R95 = RES_SMD_1206: as R1 on sheet MCU; MANF_P#: -; MANF: -; ASSEMBLY: ASSEMBLY; PRICE: -; PARAM2: -
U18 = ZXMP10A13FTA: as U6 on sheet signal-light-1; Purchase-URL: https://pricing.snapeda.com/search/part/ZXMP10A13FTA/?ref=eda; Package: SOT-23-3 Diodes Inc.; SnapEDA_Link: https://www.snapeda.com/parts/ZXMP10A13FTA/Diodes+Inc./view-part/?ref=snap; Availability: In Stock; Value: *; MP: ZXMP10A13FTA; Check_prices: https://www.snapeda.com/parts/ZXMP10A13FTA/Diodes+Inc./view-part/?ref=eda; Price: None
U19 = INA180A1IDBVR: as U7 on sheet signal-light-1; SnapEDA_Link: https://www.snapeda.com/parts/INA180A1IDBVR/Texas+Instruments/view-part/?ref=snap; Package: SOT-23-5 Texas Instruments; Value: *; MP: INA180A1IDBVR; Check_prices: https://www.snapeda.com/parts/INA180A1IDBVR/Texas+Instruments/view-part/?ref=eda

## Sheet signal-light-8.SchDoc
size A4; SheetNumber: 11; SheetTotal: 21
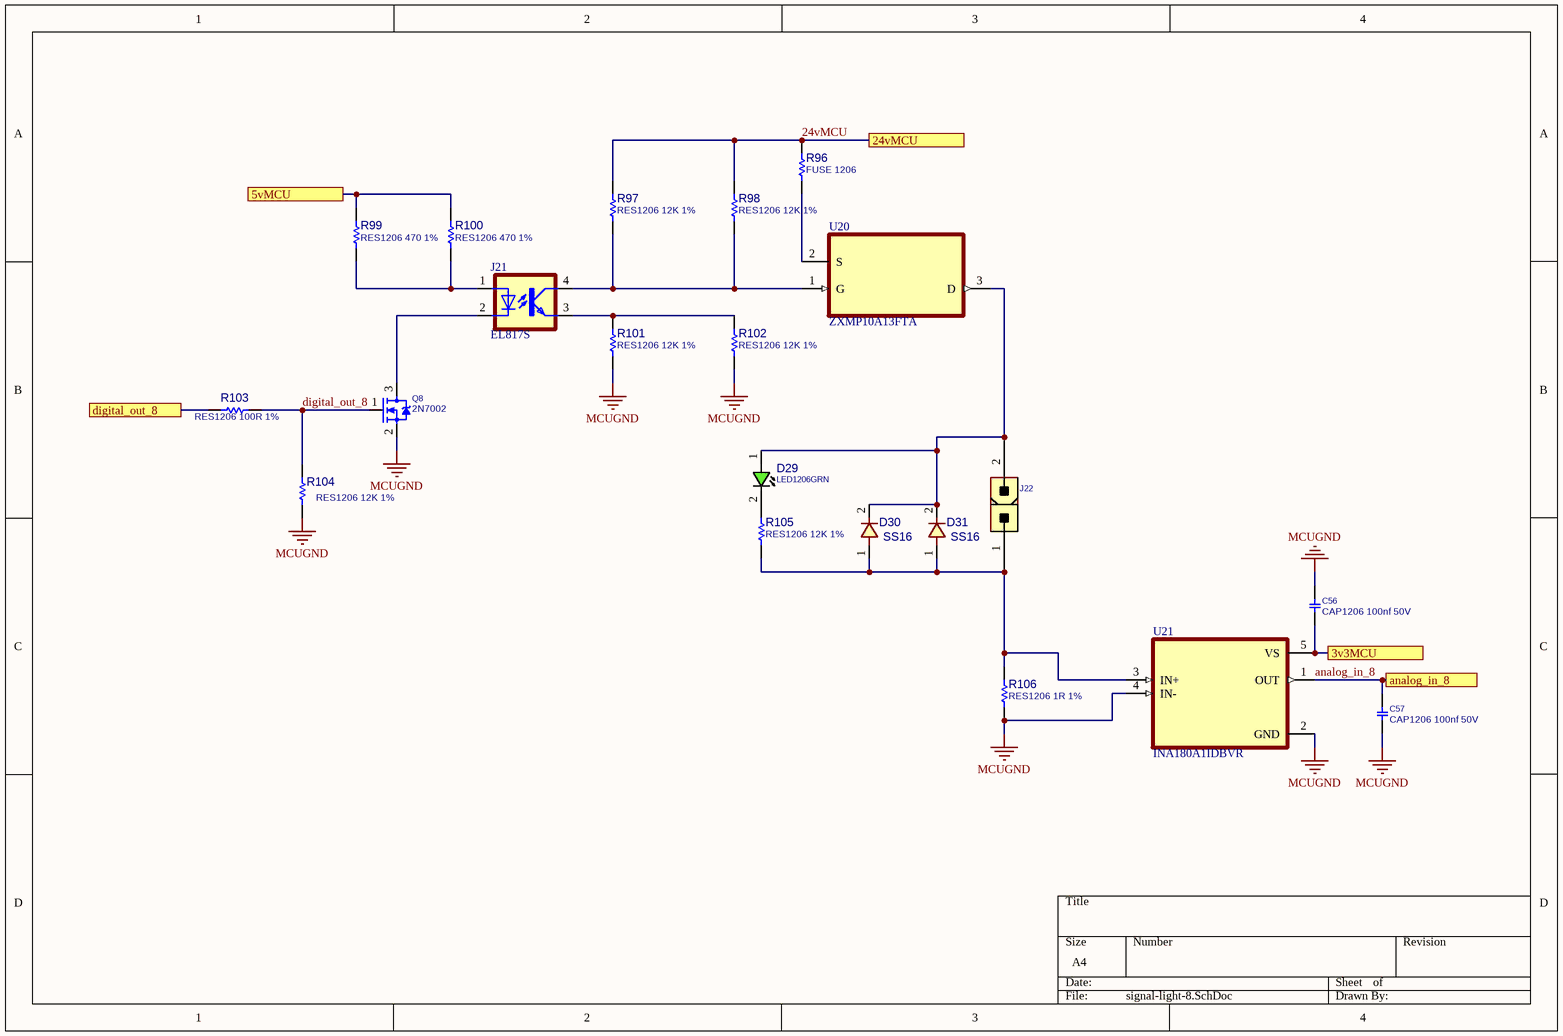
[diagram p10: signal-light-8.SchDoc]

### Parts
C56  CAP1206 100nf 50V  [C1206]
C57  CAP1206 100nf 50V  [C1206]
D29  LED1206GRN  [LED1206GRN]
D30  SS16  [D_SMA]
D31  SS16  [D_SMA]
J21  EL817S  [SOIC254P1030X460-4N]
J22  CONN_ATXPWR_2  [ATXPWR_2]  (value not drawn)
Q8  2N7002  [SOT23_3]
R96  FUSE 1206  [R1206]
R97  RES1206 12K 1%  [R1206]
R98  RES1206 12K 1%  [R1206]
R99  RES1206 470 1%  [R1206]
R100  RES1206 470 1%  [R1206]
R101  RES1206 12K 1%  [R1206]
R102  RES1206 12K 1%  [R1206]
R103  RES1206 100R 1%  [R1206]
R104  RES1206 12K 1%  [R1206]
R105  RES1206 12K 1%  [R1206]
R106  RES1206 1R 1%  [R1206]
U20  ZXMP10A13FTA  [SOT95P230X110-3N]
U21  INA180A1IDBVR  [SOT95P280X145-5N]

### Ports
3v3MCU, 5vMCU, 24vMCU, analog_in_8, digital_out_8

### Nets
MCUGND: C56.1 C57.2 Q8.2(SOURCE) R101.2 R102.2 R104.2 R106.2 U21.2(GND) U21.4(IN-)
3v3MCU: C56.2 U21.5(VS) ; port 3v3MCU
5vMCU: R99.2 R100.2 ; port 5vMCU
24vMCU: R96.1 R97.1 R98.1 ; port 24vMCU
analog_in_8: C57.1 U21.1(OUT) ; port analog_in_8
digital_out_8: Q8.1(GATE) R103.2 R104.1
NetD29_1: D29.1(ANODE) D30.2 D31.2 J22.2 U20.3(D)
NetD29_2: D29.2(CATHODE) R105.1
NetD30_1: D30.1 D31.1 J22.1 R105.2 R106.1 U21.3(IN+)
NetJ21_1: J21.1(A) R99.1 R100.1
NetJ21_2: J21.2(C) Q8.3(DRAIN)
NetJ21_3: J21.3(EMIT) R101.1 R102.1
NetJ21_4: J21.4(COL) R97.2 R98.2 U20.1(G)
NetR96_2: R96.2 U20.2(S)
NetR103_1: R103.1 ; port digital_out_8

### Library data of the parts
C56 C57 = CAP_SMD_MLCC_1206: as C1 on sheet MCU; PRICE: 100= 1$; MANF: -; ASSEMBLY: ASSEMBLY
D29 = LED_SMD_1206_GRN: as D2 on sheet power; MANF: -; ASSEMBLY: ASSEMBLY; PRICE: 36t@Javan; MANF_P#: -; VALUE: LED1206GRN; MountType: SMT; PartType: LED
D30 D31 = DIODE_SMD_1N4001: as D9 on sheet signal-light-1; MANF: MANF; ASSEMBLY: ASSEMBLY; PRICE: PRICE; VALUE: SS16
J21 = EL817S: as J7 on sheet signal-light-1; SnapEDA_Link: https://www.snapeda.com/parts/EL817S/Everlight+Electronics+Co+Ltd/view-part/?ref=snap; Package: SMD-4 Everlight Electronics Co Ltd; Value: *; MP: EL817S; Check_prices: https://www.snapeda.com/parts/EL817S/Everlight+Electronics+Co+Ltd/view-part/?ref=eda
J22 = CONN_ATXPWR_2: as POWER1 on sheet power; VALUE: CONN_ATXPWR_2; MountType: THD; PACKAGE: ATXPWR-2pin; Part Type: Conn.
Q8 = MOSN_2N7002_SOT23: MOSFET, N-CH, 60V, 0.3A; MANF: NXP; ASSEMBLY: ASSEMBLY; MANF_P#: 2N7002; PARAM2: 60v; PARAM: 0.3A; PRICE: 0.3t@Javan; VALUE: 2N7002
R96-R106 = RES_SMD_1206: as R1 on sheet MCU; MANF_P#: -; MANF: -; ASSEMBLY: ASSEMBLY; PRICE: -; PARAM2: -
U20 = ZXMP10A13FTA: as U6 on sheet signal-light-1; Purchase-URL: https://pricing.snapeda.com/search/part/ZXMP10A13FTA/?ref=eda; Package: SOT-23-3 Diodes Inc.; SnapEDA_Link: https://www.snapeda.com/parts/ZXMP10A13FTA/Diodes+Inc./view-part/?ref=snap; Availability: In Stock; Value: *; MP: ZXMP10A13FTA; Check_prices: https://www.snapeda.com/parts/ZXMP10A13FTA/Diodes+Inc./view-part/?ref=eda; Price: None
U21 = INA180A1IDBVR: as U7 on sheet signal-light-1; SnapEDA_Link: https://www.snapeda.com/parts/INA180A1IDBVR/Texas+Instruments/view-part/?ref=snap; Package: SOT-23-5 Texas Instruments; Value: *; MP: INA180A1IDBVR; Check_prices: https://www.snapeda.com/parts/INA180A1IDBVR/Texas+Instruments/view-part/?ref=eda

## Sheet signal-light-9.SchDoc
size A4; SheetNumber: 12; SheetTotal: 21
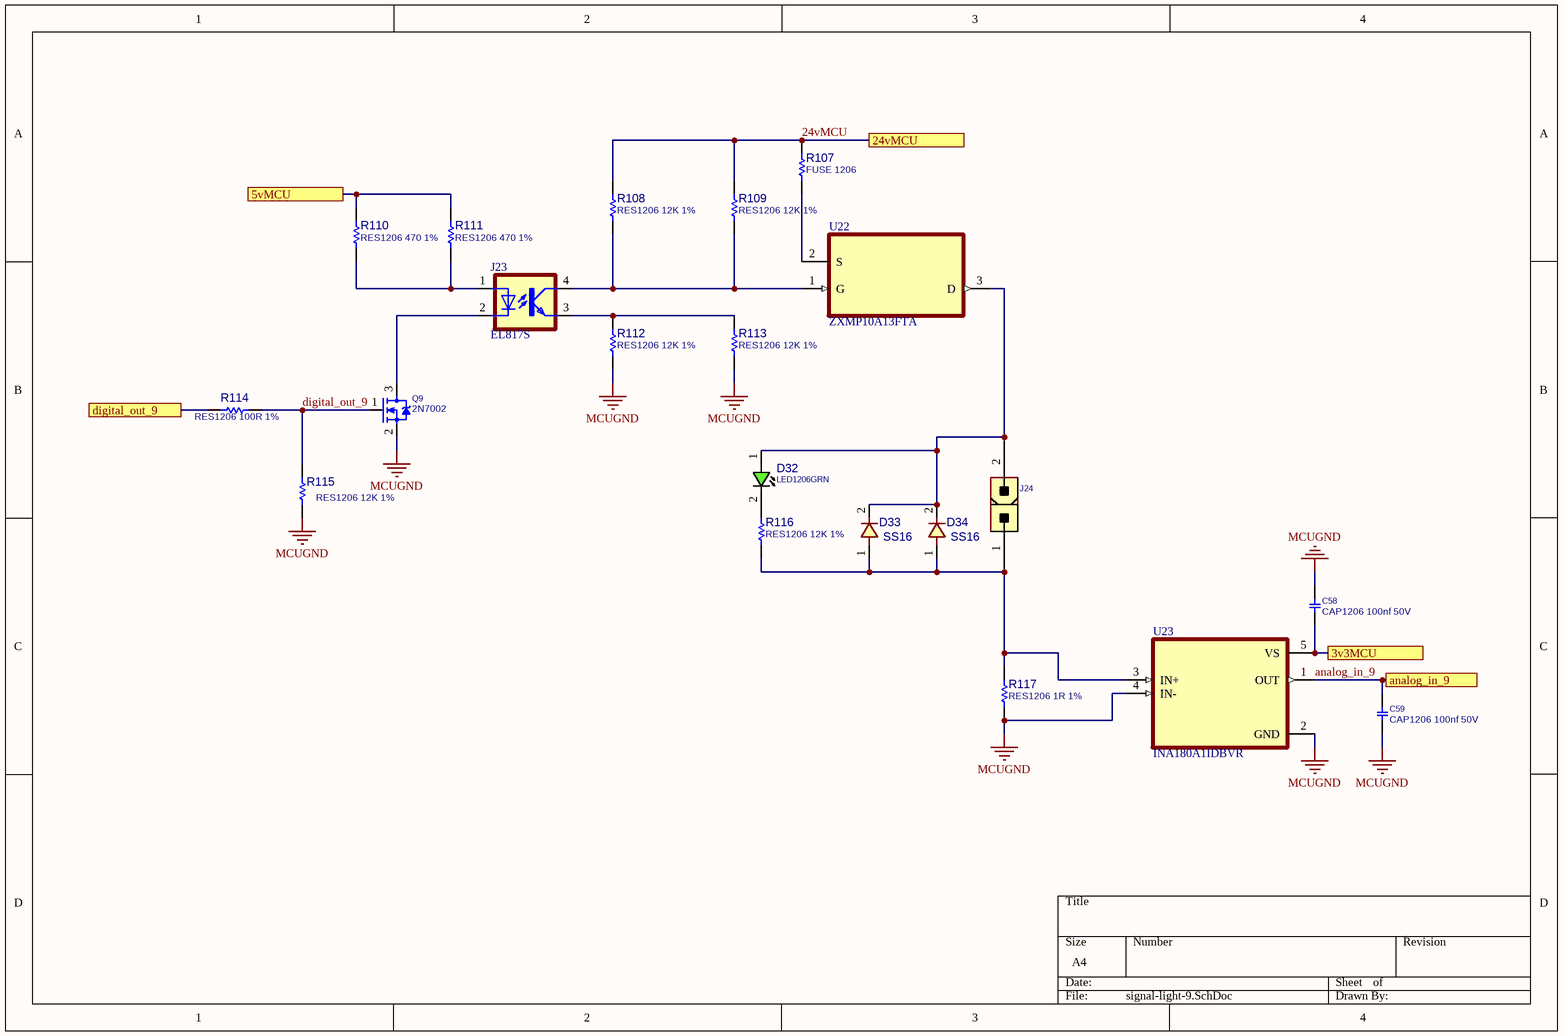
[diagram p11: signal-light-9.SchDoc]

### Parts
C58  CAP1206 100nf 50V  [C1206]
C59  CAP1206 100nf 50V  [C1206]
D32  LED1206GRN  [LED1206GRN]
D33  SS16  [D_SMA]
D34  SS16  [D_SMA]
J23  EL817S  [SOIC254P1030X460-4N]
J24  CONN_ATXPWR_2  [ATXPWR_2]  (value not drawn)
Q9  2N7002  [SOT23_3]
R107  FUSE 1206  [R1206]
R108  RES1206 12K 1%  [R1206]
R109  RES1206 12K 1%  [R1206]
R110  RES1206 470 1%  [R1206]
R111  RES1206 470 1%  [R1206]
R112  RES1206 12K 1%  [R1206]
R113  RES1206 12K 1%  [R1206]
R114  RES1206 100R 1%  [R1206]
R115  RES1206 12K 1%  [R1206]
R116  RES1206 12K 1%  [R1206]
R117  RES1206 1R 1%  [R1206]
U22  ZXMP10A13FTA  [SOT95P230X110-3N]
U23  INA180A1IDBVR  [SOT95P280X145-5N]

### Ports
3v3MCU, 5vMCU, 24vMCU, analog_in_9, digital_out_9

### Nets
MCUGND: C58.1 C59.2 Q9.2(SOURCE) R112.2 R113.2 R115.2 R117.2 U23.2(GND) U23.4(IN-)
3v3MCU: C58.2 U23.5(VS) ; port 3v3MCU
5vMCU: R110.2 R111.2 ; port 5vMCU
24vMCU: R107.1 R108.1 R109.1 ; port 24vMCU
analog_in_9: C59.1 U23.1(OUT) ; port analog_in_9
digital_out_9: Q9.1(GATE) R114.2 R115.1
NetD32_1: D32.1(ANODE) D33.2 D34.2 J24.2 U22.3(D)
NetD32_2: D32.2(CATHODE) R116.1
NetD33_1: D33.1 D34.1 J24.1 R116.2 R117.1 U23.3(IN+)
NetJ23_1: J23.1(A) R110.1 R111.1
NetJ23_2: J23.2(C) Q9.3(DRAIN)
NetJ23_3: J23.3(EMIT) R112.1 R113.1
NetJ23_4: J23.4(COL) R108.2 R109.2 U22.1(G)
NetR107_2: R107.2 U22.2(S)
NetR114_1: R114.1 ; port digital_out_9

### Library data of the parts
C58 C59 = CAP_SMD_MLCC_1206: as C1 on sheet MCU; PRICE: 100= 1$; MANF: -; ASSEMBLY: ASSEMBLY
D32 = LED_SMD_1206_GRN: as D2 on sheet power; MANF: -; ASSEMBLY: ASSEMBLY; PRICE: 36t@Javan; MANF_P#: -; VALUE: LED1206GRN; MountType: SMT; PartType: LED
D33 D34 = DIODE_SMD_1N4001: as D9 on sheet signal-light-1; MANF: MANF; ASSEMBLY: ASSEMBLY; PRICE: PRICE; VALUE: SS16
J23 = EL817S: as J7 on sheet signal-light-1; SnapEDA_Link: https://www.snapeda.com/parts/EL817S/Everlight+Electronics+Co+Ltd/view-part/?ref=snap; Package: SMD-4 Everlight Electronics Co Ltd; Value: *; MP: EL817S; Check_prices: https://www.snapeda.com/parts/EL817S/Everlight+Electronics+Co+Ltd/view-part/?ref=eda
J24 = CONN_ATXPWR_2: as POWER1 on sheet power; VALUE: CONN_ATXPWR_2; MountType: THD; PACKAGE: ATXPWR-2pin; Part Type: Conn.
Q9 = MOSN_2N7002_SOT23: MOSFET, N-CH, 60V, 0.3A; MANF: NXP; ASSEMBLY: ASSEMBLY; MANF_P#: 2N7002; PARAM2: 60v; PARAM: 0.3A; PRICE: 0.3t@Javan; VALUE: 2N7002
R107-R117 = RES_SMD_1206: as R1 on sheet MCU; MANF_P#: -; MANF: -; ASSEMBLY: ASSEMBLY; PRICE: -; PARAM2: -
U22 = ZXMP10A13FTA: as U6 on sheet signal-light-1; Purchase-URL: https://pricing.snapeda.com/search/part/ZXMP10A13FTA/?ref=eda; Package: SOT-23-3 Diodes Inc.; SnapEDA_Link: https://www.snapeda.com/parts/ZXMP10A13FTA/Diodes+Inc./view-part/?ref=snap; Availability: In Stock; Value: *; MP: ZXMP10A13FTA; Check_prices: https://www.snapeda.com/parts/ZXMP10A13FTA/Diodes+Inc./view-part/?ref=eda; Price: None
U23 = INA180A1IDBVR: as U7 on sheet signal-light-1; SnapEDA_Link: https://www.snapeda.com/parts/INA180A1IDBVR/Texas+Instruments/view-part/?ref=snap; Package: SOT-23-5 Texas Instruments; Value: *; MP: INA180A1IDBVR; Check_prices: https://www.snapeda.com/parts/INA180A1IDBVR/Texas+Instruments/view-part/?ref=eda